# Altium project CW341_KintexUltraScaleTarget.PrjPcb (part 1 of 3)
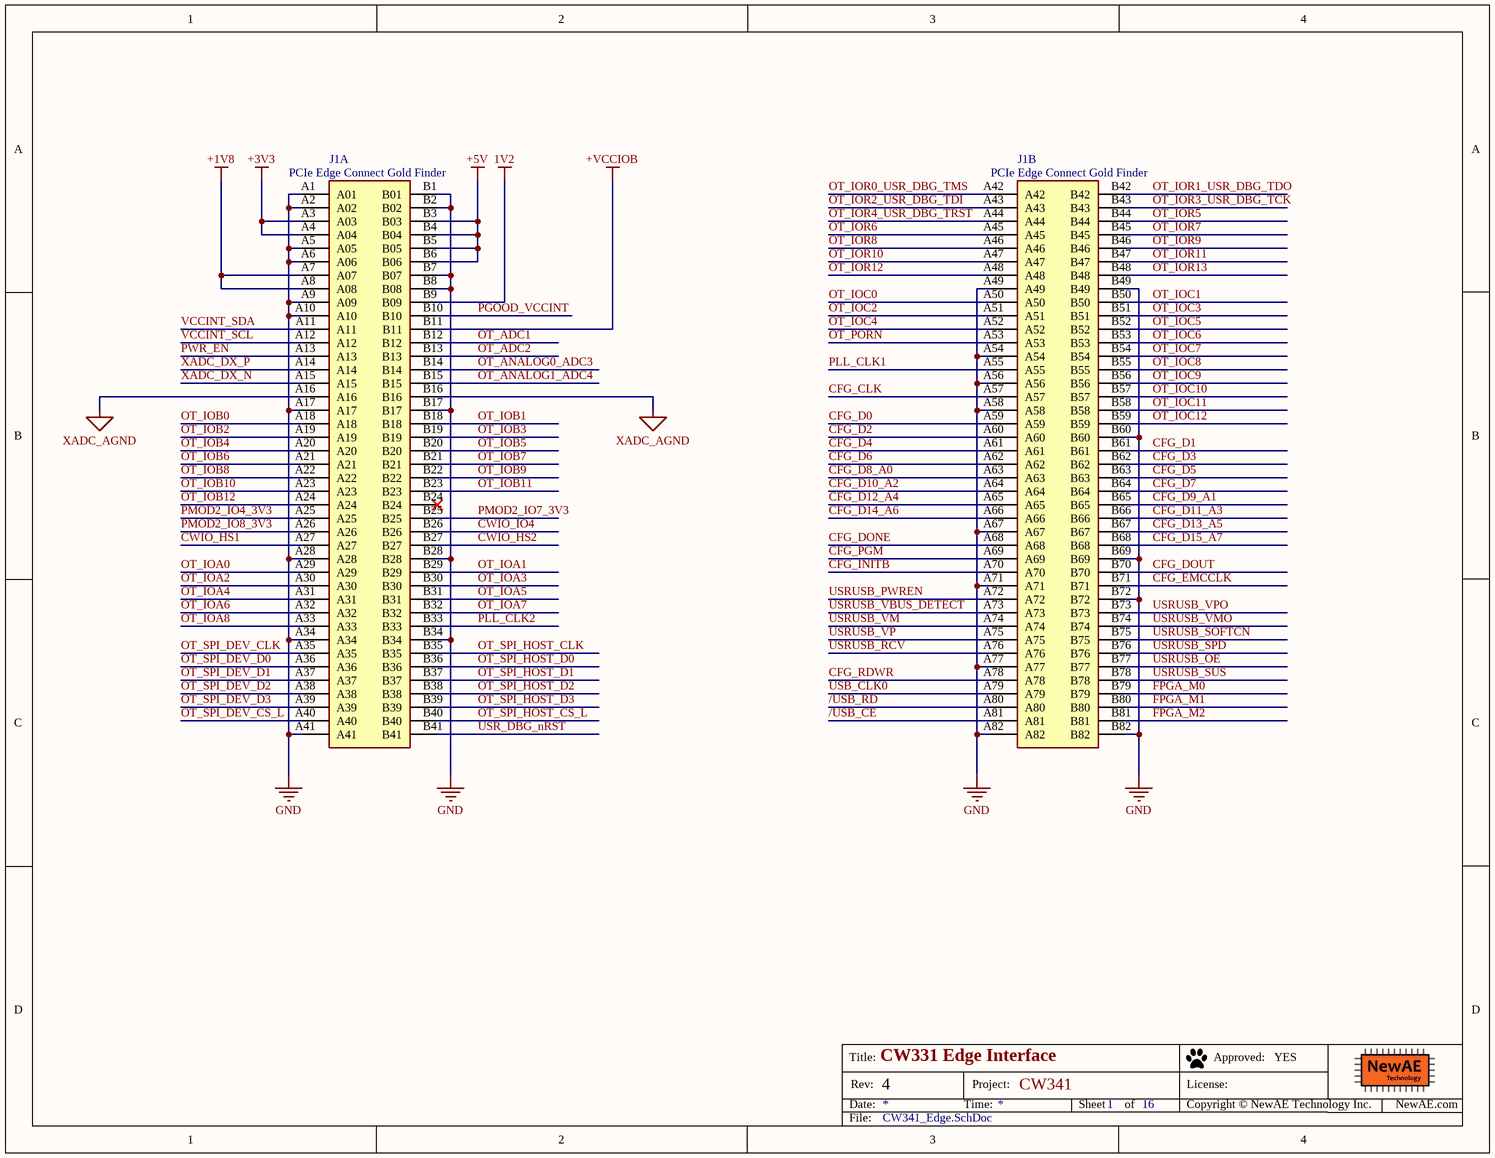
[diagram p0: CW341_Edge.SchDoc]
Sch_date: 01/17/2023; PrjRev: 4; PrjName: CW341
16 sheets, 157 parts. Net scope: global (net labels, ports and power ports of the same name join across sheets).
Board file: CW341_KintexUSTarget.PcbDoc
Sheets:
  CW341_Edge.SchDoc
  CW341_FPGA_DECOUP.SchDoc
  CW341_FPGA_PWR.SchDoc
  CW341_FPGA_CFG.SchDoc
  CW341_FPGA_MGT.SchDoc
  CW341_FPGAIO_1.SchDoc
  CW341_FPGAIO_2.SchDoc
  CW341_FPGAIO_3.SchDoc
  CW341_FPGAIO_4.SchDoc
  CW341_FPGAIO_5.SchDoc
  CW341_HeatsinkFan.SchDoc
  CW341_PowerMeasure.SchDoc
  CW341_SRAM.SchDoc
  CW341_XADC.SchDoc
  CW341_HyperRam.SchDoc
  CW341_FPGA_USERIOA.SchDoc

## Sheet CW341_Edge.SchDoc: CW331 Edge Interface
size Letter; Organization: NewAE Technology Inc.; Address1: 1083 Queen St., Suite 196; Address2: Halifax; Address3: NS; Address4: Canada B3H 0B2; SheetNumber: 1; SheetTotal: 16; SheetApproved: YES

### Parts
J1  PCIe Edge Connect Gold Finder  [PCIeX16-GF-2D-1000-1K-O164]  (parts A,B of 2)

### Nets
1V2: J1.B9(B09)
+1V8: J1.A7(A07) J1.A8(A08)
+3V3: J1.A3(A03) J1.A4(A04)
+5V: J1.B3(B03) J1.B4(B04) J1.B5(B05) J1.B6(B06)
+VCCIOB: J1.B11
GND: J1.A1(A01) J1.A2(A02) J1.A5(A05) J1.A6(A06) J1.A9(A09) J1.A10 J1.A17 J1.A28 J1.A34 J1.A41 J1.A49 J1.A54 J1.A56 J1.A58 J1.A67 J1.A71 J1.A77 J1.A82 J1.B1(B01) J1.B2(B02) J1.B7(B07) J1.B8(B08) J1.B17 J1.B28 J1.B34 J1.B49 J1.B60 J1.B69 J1.B72 J1.B82
XADC_AGND: J1.A16 J1.B16  [project net XADC_VREF_N]
/USB_CE: J1.A81
/USB_RD: J1.A80
CFG_CLK: J1.A57
CFG_D0: J1.A59
CFG_D1: J1.B61
CFG_D2: J1.A60
CFG_D3: J1.B62
CFG_D4: J1.A61
CFG_D5: J1.B63
CFG_D6: J1.A62
CFG_D7: J1.B64
CFG_D8_A0: J1.A63
CFG_D9_A1: J1.B65
CFG_D10_A2: J1.A64
CFG_D11_A3: J1.B66
CFG_D12_A4: J1.A65
CFG_D13_A5: J1.B67
CFG_D14_A6: J1.A66
CFG_D15_A7: J1.B68
CFG_DONE: J1.A68
CFG_DOUT: J1.B70
CFG_EMCCLK: J1.B71
CFG_INITB: J1.A70
CFG_PGM: J1.A69
CFG_RDWR: J1.A78
CWIO_HS1: J1.A27
CWIO_HS2: J1.B27
CWIO_IO4: J1.B26
FPGA_M0: J1.B79
FPGA_M1: J1.B80
FPGA_M2: J1.B81
OT_ADC1: J1.B12
OT_ADC2: J1.B13
OT_ANALOG0_ADC3: J1.B14
OT_ANALOG1_ADC4: J1.B15
OT_IOA0: J1.A29
OT_IOA1: J1.B29
OT_IOA2: J1.A30
OT_IOA3: J1.B30
OT_IOA4: J1.A31
OT_IOA5: J1.B31
OT_IOA6: J1.A32
OT_IOA7: J1.B32
OT_IOA8: J1.A33
OT_IOB0: J1.A18
OT_IOB1: J1.B18
OT_IOB2: J1.A19
OT_IOB3: J1.B19
OT_IOB4: J1.A20
OT_IOB5: J1.B20
OT_IOB6: J1.A21
OT_IOB7: J1.B21
OT_IOB8: J1.A22
OT_IOB9: J1.B22
OT_IOB10: J1.A23
OT_IOB11: J1.B23
OT_IOB12: J1.A24
OT_IOC0: J1.A50
OT_IOC1: J1.B50
OT_IOC2: J1.A51
OT_IOC3: J1.B51
OT_IOC4: J1.A52
OT_IOC5: J1.B52
OT_IOC6: J1.B53
OT_IOC7: J1.B54
OT_IOC8: J1.B55
OT_IOC9: J1.B56
OT_IOC10: J1.B57
OT_IOC11: J1.B58
OT_IOC12: J1.B59
OT_IOR0_USR_DBG_TMS: J1.A42
OT_IOR1_USR_DBG_TDO: J1.B42
OT_IOR2_USR_DBG_TDI: J1.A43
OT_IOR3_USR_DBG_TCK: J1.B43
OT_IOR4_USR_DBG_TRST: J1.A44
OT_IOR5: J1.B44
OT_IOR6: J1.A45
OT_IOR7: J1.B45
OT_IOR8: J1.A46
OT_IOR9: J1.B46
OT_IOR10: J1.A47
OT_IOR11: J1.B47
OT_IOR12: J1.A48
OT_IOR13: J1.B48
OT_PORN: J1.A53
OT_SPI_DEV_CLK: J1.A35
OT_SPI_DEV_CS_L: J1.A40
OT_SPI_DEV_D0: J1.A36
OT_SPI_DEV_D1: J1.A37
OT_SPI_DEV_D2: J1.A38
OT_SPI_DEV_D3: J1.A39
OT_SPI_HOST_CLK: J1.B35
OT_SPI_HOST_CS_L: J1.B40
OT_SPI_HOST_D0: J1.B36
OT_SPI_HOST_D1: J1.B37
OT_SPI_HOST_D2: J1.B38
OT_SPI_HOST_D3: J1.B39
PGOOD_VCCINT: J1.B10
PLL_CLK1: J1.A55
PLL_CLK2: J1.B33
PMOD2_IO4_3V3: J1.A25
PMOD2_IO7_3V3: J1.B25
PMOD2_IO8_3V3: J1.A26
PWR_EN: J1.A13
USB_CLK0: J1.A79
USR_DBG_nRST: J1.B41
USRUSB_OE: J1.B77
USRUSB_PWREN: J1.A72
USRUSB_RCV: J1.A76
USRUSB_SOFTCN: J1.B75
USRUSB_SPD: J1.B76
USRUSB_SUS: J1.B78
USRUSB_VBUS_DETECT: J1.A73
USRUSB_VM: J1.A74
USRUSB_VMO: J1.B74
USRUSB_VP: J1.A75
USRUSB_VPO: J1.B73
VCCINT_SCL: J1.A12
VCCINT_SDA: J1.A11
XADC_DX_N: J1.A15
XADC_DX_P: J1.A14

Not connected (* = marked no-connect by the designer): J1 B24*

### Notes on the sheet
- Title:
- Date:
- Rev:
- Time:
- Project:
- Sheet
- of
- License:
- Copyright © NewAE Technology Inc.
- Approved:
- NewAE.com
- File:

### Library data of the parts
J1 = PCIe x16 Connector Edge (gold finger, x8 mode): Edge Fingers No Part to Install; MF: NA; MP: PCIE-164-02-X-D-RA; Value: *; Price: NA; Package: PCIeX16-GF-2D-1000-1K-O164

## Sheet CW341_FPGA_DECOUP.SchDoc: FPGA Decoupling
size Letter; SheetNumber: 2; SheetTotal: 16; SheetApproved: YES; Application_BuildNumber: .
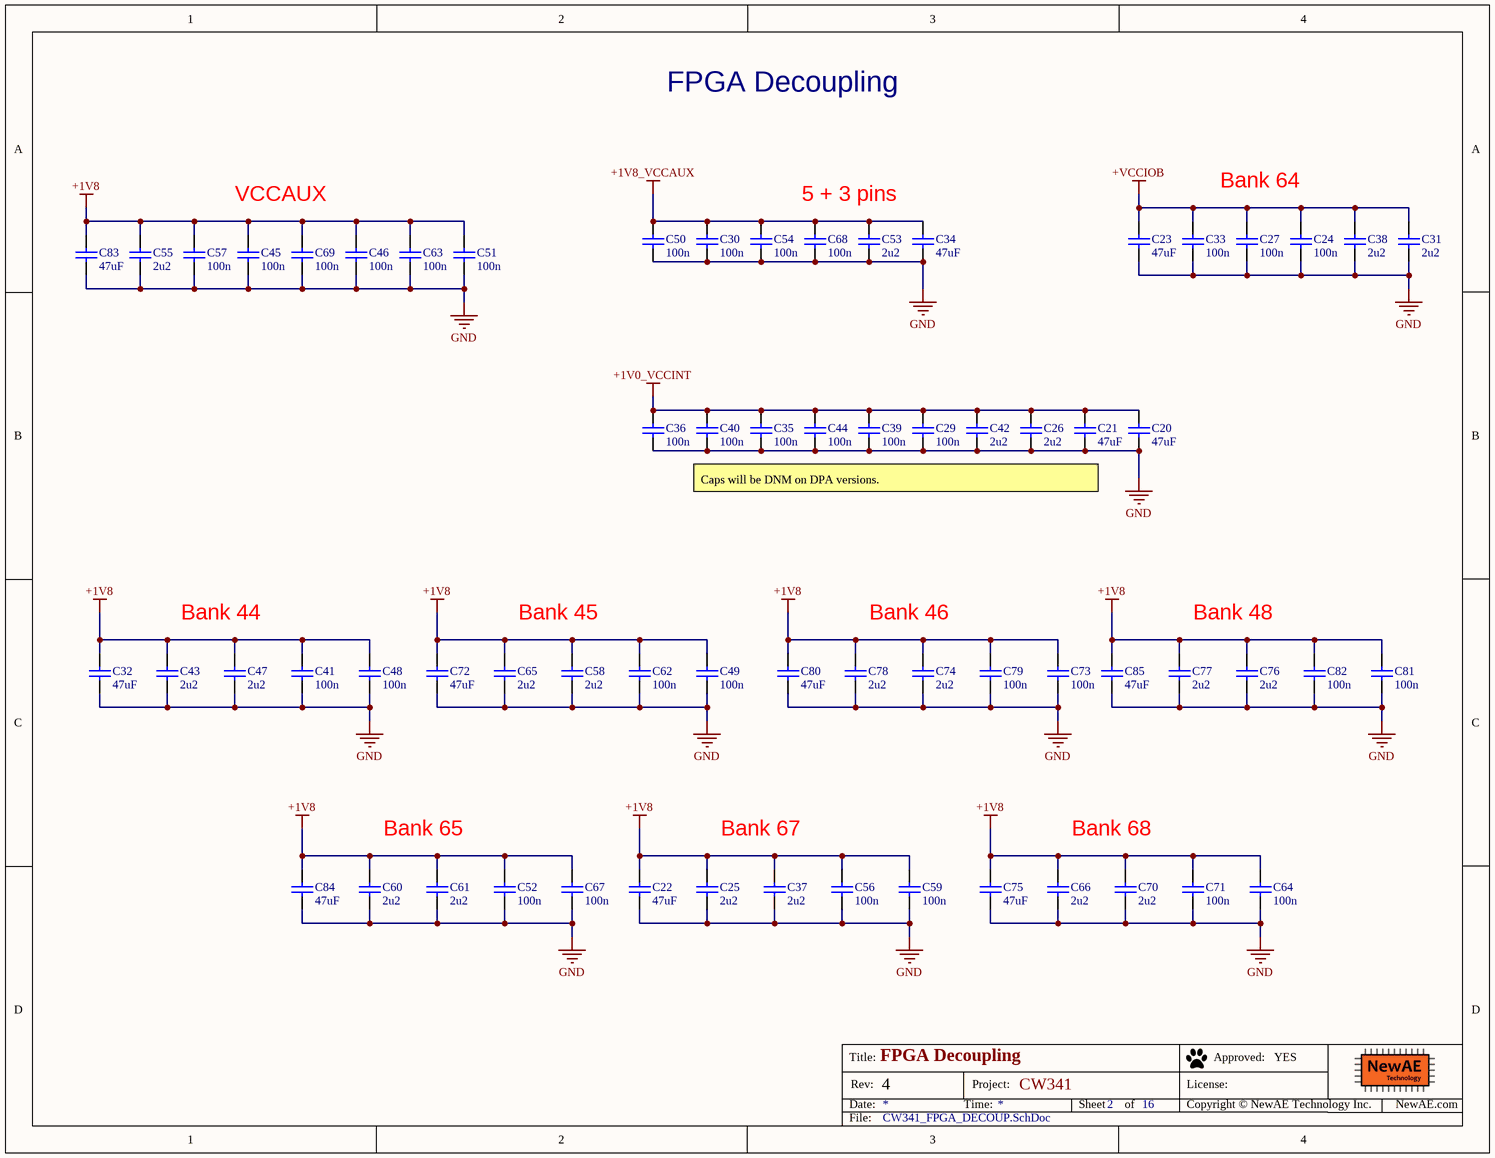
[diagram p1: CW341_FPGA_DECOUP.SchDoc]

### Parts
C20  47uF  [CAPC3225X20N]
C21  47uF  [CAPC3225X20N]
C22  47uF  [CAPC3225X20N]
C23  47uF  [CAPC3225X20N]
C24  100n  [CAPC0402_M]
C25  2u2  [CAPC0603_M]
C26  2u2  [CAPC0603_M]
C27  100n  [CAPC0402_M]
C29  100n  [CAPC0402_M]
C30  100n  [CAPC0402_M]
C31  2u2  [CAPC0603_M]
C32  47uF  [CAPC3225X20N]
C33  100n  [CAPC0402_M]
C34  47uF  [CAPC3225X20N]
C35  100n  [CAPC0402_M]
C36  100n  [CAPC0402_M]
C37  2u2  [CAPC0603_M]
C38  2u2  [CAPC0603_M]
C39  100n  [CAPC0402_M]
C40  100n  [CAPC0402_M]
C41  100n  [CAPC0402_M]
C42  2u2  [CAPC0603_M]
C43  2u2  [CAPC0603_M]
C44  100n  [CAPC0402_M]
C45  100n  [CAPC0402_M]
C46  100n  [CAPC0402_M]
C47  2u2  [CAPC0603_M]
C48  100n  [CAPC0402_M]
C49  100n  [CAPC0402_M]
C50  100n  [CAPC0402_M]
C51  100n  [CAPC0402_M]
C52  100n  [CAPC0402_M]
C53  2u2  [CAPC0603_M]
C54  100n  [CAPC0402_M]
C55  2u2  [CAPC0603_M]
C56  100n  [CAPC0402_M]
C57  100n  [CAPC0402_M]
C58  2u2  [CAPC0603_M]
C59  100n  [CAPC0402_M]
C60  2u2  [CAPC0603_M]
C61  2u2  [CAPC0603_M]
C62  100n  [CAPC0402_M]
C63  100n  [CAPC0402_M]
C64  100n  [CAPC0402_M]
C65  2u2  [CAPC0603_M]
C66  2u2  [CAPC0603_M]
C67  100n  [CAPC0402_M]
C68  100n  [CAPC0402_M]
C69  100n  [CAPC0402_M]
C70  2u2  [CAPC0603_M]
C71  100n  [CAPC0402_M]
C72  47uF  [CAPC3225X20N]
C73  100n  [CAPC0402_M]
C74  2u2  [CAPC0603_M]
C75  47uF  [CAPC3225X20N]
C76  2u2  [CAPC0603_M]
C77  2u2  [CAPC0603_M]
C78  2u2  [CAPC0603_M]
C79  100n  [CAPC0402_M]
C80  47uF  [CAPC3225X20N]
C81  100n  [CAPC0402_M]
C82  100n  [CAPC0402_M]
C83  47uF  [CAPC3225X20N]
C84  47uF  [CAPC3225X20N]
C85  47uF  [CAPC3225X20N]

### Nets
+1V0_VCCINT: C20.1 C21.1 C26.1 C29.1 C35.1 C36.1 C39.1 C40.1 C42.1 C44.1
+1V8: C22.1 C25.1 C30.1 C32.1 C34.1 C37.1 C41.1 C43.1 C45.1 C46.1 C47.1 C48.1 C49.1 C50.1 C51.1 C52.1 C53.1 C54.1 C55.1 C56.1 C57.1 C58.1 C59.1 C60.1 C61.1 C62.1 C63.1 C64.1 C65.1 C66.1 C67.1 C68.1 C69.1 C70.1 C71.1 C72.1 C73.1 C74.1 C75.1 C76.1 C77.1 C78.1 C79.1 C80.1 C81.1 C82.1 C83.1 C84.1 C85.1  [also labelled +1V8_VCCAUX]
+VCCIOB: C23.1 C24.1 C27.1 C31.1 C33.1 C38.1
GND: C20.2 C21.2 C22.2 C23.2 C24.2 C25.2 C26.2 C27.2 C29.2 C30.2 C31.2 C32.2 C33.2 C34.2 C35.2 C36.2 C37.2 C38.2 C39.2 C40.2 C41.2 C42.2 C43.2 C44.2 C45.2 C46.2 C47.2 C48.2 C49.2 C50.2 C51.2 C52.2 C53.2 C54.2 C55.2 C56.2 C57.2 C58.2 C59.2 C60.2 C61.2 C62.2 C63.2 C64.2 C65.2 C66.2 C67.2 C68.2 C69.2 C70.2 C71.2 C72.2 C73.2 C74.2 C75.2 C76.2 C77.2 C78.2 C79.2 C80.2 C81.2 C82.2 C83.2 C84.2 C85.2

### Notes on the sheet
- FPGA Decoupling
- VCCAUX
- 5 + 3 pins
- Bank 64
- Caps will be DNM on DPA versions.
- Bank 44
- Bank 45
- Bank 46
- Bank 48
- Bank 65
- Bank 67
- Bank 68
- Title:
- Date:
- Rev:
- Time:
- Project:
- Sheet
- of
- License:
- Copyright © NewAE Technology Inc.
- Approved:
- NewAE.com
- File:

### Library data of the parts
C20-C23 C32 C34 C72 C75 C80 C83-C85 = CCHIP-47u-1210: 47u, 10V, 1210, Ceramic; Manufacture 1: TDK Corporation; Manufacture Part Number 1: C3225X5R1A476M250AC; Component Group: Capacitor; Case-EIA: 1210; Case-Metric: 3225; Rated Voltage: 10VDC; Tolerance: 20%; Part Number: CCHIP-47u-1210; Footprint: 1210; Pin Count: 2; Supplier 1: Digi-Key; Supplier Part Number 1: 445-6711-1-ND; Value: 47uF; Mounting Technology: SMT; Temperature Range: -55C to 85C; Component Kind: Standard; Component Type: Standard
C24 C27 C29 C30 C33 C35 C36 C39-C41 C44-C46 C48-C52 C54 C56 C57 C59 C62-C64 C67-C69 C71 C73 C79 C81 C82 = CCHIP-100n-0402: 100n, 0402; Manufacture Part Number 1: CGA2B3X7R1V104K050BB; Component Group: Capacitor; Case-EIA: 0402; Part Number: CCHIP-100n-0402; Footprint: 0402; Pin Count: 2; Value: 100n; Mounting Technology: SMT; Component Kind: Standard; Component Type: Standard; Supplier 1: Digi-Key; Supplier Part Number 1: 445-6901-1-ND
C25 C26 C31 C37 C38 C42 C43 C47 C53 C55 C58 C60 C61 C65 C66 C70 C74 C76-C78 = CCHIP-2u2-0603: 2u2, 0603; Manufacture 1: Samsung; Manufacture Part Number 1: CL10B225KP8NNNC; Component Group: Capacitor; Case-EIA: 0603; Case-Metric: 1608; Rated Voltage: 10VDC; Part Number: CCHIP-2u2-0603; Footprint: 0603; Pin Count: 2; Supplier 1: Digi-Key; Supplier Part Number 1: 1276-1134-1-ND; Value: 2u2; Mounting Technology: SMT; Component Kind: Standard; Component Type: Standard

## Sheet CW341_FPGA_PWR.SchDoc: Kintex Power Connections
size Letter; Organization: NewAE Technology Inc.; Address1: 1083 Queen St., Suite 196; Address2: Halifax; Address3: NS; Address4: Canada B3H 0B2; SheetNumber: 3; SheetTotal: 16; SheetApproved: YES
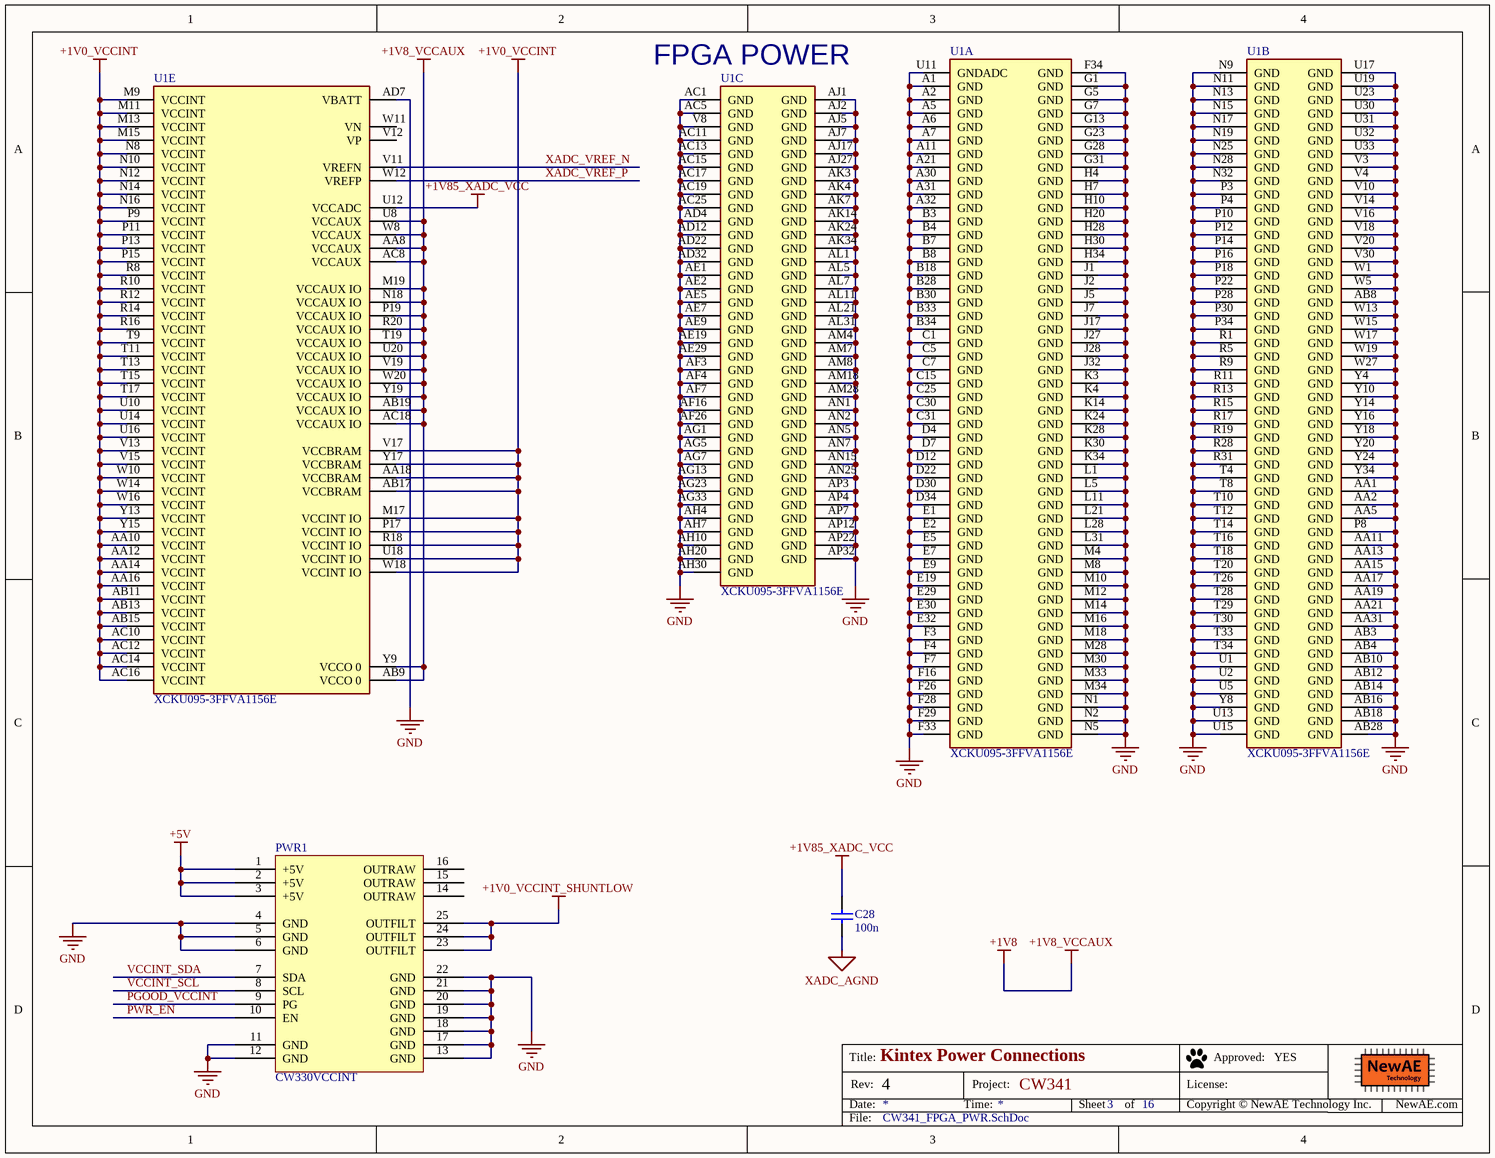
[diagram p2: CW341_FPGA_PWR.SchDoc]

### Parts
C28  100n  [CAPC0402_M]
PWR1  CW330VCCINT  [CW335_VCCINT_POWERSUPPLY]
U1  XCKU095-3FFVA1156E  [FP-XCKU060-3FFVA1156E-MFG]  (parts A,B,C,E of 23)

### Nets
+1V0_VCCINT: U1.AA10(VCCINT) U1.AA12(VCCINT) U1.AA14(VCCINT) U1.AA16(VCCINT) U1.AA18(VCCBRAM) U1.AB11(VCCINT) U1.AB13(VCCINT) U1.AB15(VCCINT) U1.AB17(VCCBRAM) U1.AC10(VCCINT) U1.AC12(VCCINT) U1.AC14(VCCINT) U1.AC16(VCCINT) U1.M9(VCCINT) U1.M11(VCCINT) U1.M13(VCCINT) U1.M15(VCCINT) U1.M17(VCCINT_IO) U1.N8(VCCINT) U1.N10(VCCINT) U1.N12(VCCINT) U1.N14(VCCINT) U1.N16(VCCINT) U1.P9(VCCINT) U1.P11(VCCINT) U1.P13(VCCINT) U1.P15(VCCINT) U1.P17(VCCINT_IO) U1.R8(VCCINT) U1.R10(VCCINT) U1.R12(VCCINT) U1.R14(VCCINT) U1.R16(VCCINT) U1.R18(VCCINT_IO) U1.T9(VCCINT) U1.T11(VCCINT) U1.T13(VCCINT) U1.T15(VCCINT) U1.T17(VCCINT) U1.U10(VCCINT) U1.U14(VCCINT) U1.U16(VCCINT) U1.U18(VCCINT_IO) U1.V13(VCCINT) U1.V15(VCCINT) U1.V17(VCCBRAM) U1.W10(VCCINT) U1.W14(VCCINT) U1.W16(VCCINT) U1.W18(VCCINT_IO) U1.Y13(VCCINT) U1.Y15(VCCINT) U1.Y17(VCCBRAM)
+1V0_VCCINT_SHUNTLOW: PWR1.23(OUTFILT) PWR1.24(OUTFILT) PWR1.25(OUTFILT)
+1V8: U1.AA8(VCCAUX) U1.AB9(VCCO_0) U1.AB19(VCCAUX_IO) U1.AC8(VCCAUX) U1.AC18(VCCAUX_IO) U1.M19(VCCAUX_IO) U1.N18(VCCAUX_IO) U1.P19(VCCAUX_IO) U1.R20(VCCAUX_IO) U1.T19(VCCAUX_IO) U1.U8(VCCAUX) U1.U20(VCCAUX_IO) U1.V19(VCCAUX_IO) U1.W8(VCCAUX) U1.W20(VCCAUX_IO) U1.Y9(VCCO_0) U1.Y19(VCCAUX_IO)  [also labelled +1V8_VCCAUX]
+1V85_XADC_VCC: C28.1 U1.U12(VCCADC)
+5V: PWR1.1(+5V) PWR1.2(+5V) PWR1.3(+5V)
GND: PWR1.4(GND) PWR1.5(GND) PWR1.6(GND) PWR1.11(GND) PWR1.12(GND) PWR1.13(GND) PWR1.17(GND) PWR1.18(GND) PWR1.19(GND) PWR1.20(GND) PWR1.21(GND) PWR1.22(GND) U1.A1(GND) U1.A2(GND) U1.A5(GND) U1.A6(GND) U1.A7(GND) U1.A11(GND) U1.A21(GND) U1.A30(GND) U1.A31(GND) U1.A32(GND) U1.AA1(GND) U1.AA2(GND) U1.AA5(GND) U1.AA11(GND) U1.AA13(GND) U1.AA15(GND) U1.AA17(GND) U1.AA19(GND) U1.AA21(GND) U1.AA31(GND) U1.AB3(GND) U1.AB4(GND) U1.AB8(GND) U1.AB10(GND) U1.AB12(GND) U1.AB14(GND) U1.AB16(GND) U1.AB18(GND) U1.AB28(GND) U1.AC1(GND) U1.AC5(GND) U1.AC11(GND) U1.AC13(GND) U1.AC15(GND) U1.AC17(GND) U1.AC19(GND) U1.AC25(GND) U1.AD4(GND) U1.AD7(VBATT) U1.AD12(GND) U1.AD22(GND) U1.AD32(GND) U1.AE1(GND) U1.AE2(GND) U1.AE5(GND) U1.AE7(GND) U1.AE9(GND) U1.AE19(GND) U1.AE29(GND) U1.AF3(GND) U1.AF4(GND) U1.AF7(GND) U1.AF16(GND) U1.AF26(GND) U1.AG1(GND) U1.AG5(GND) U1.AG7(GND) U1.AG13(GND) U1.AG23(GND) U1.AG33(GND) U1.AH4(GND) U1.AH7(GND) U1.AH10(GND) U1.AH20(GND) U1.AH30(GND) U1.AJ1(GND) U1.AJ2(GND) U1.AJ5(GND) U1.AJ7(GND) U1.AJ17(GND) U1.AJ27(GND) U1.AK3(GND) U1.AK4(GND) U1.AK7(GND) U1.AK14(GND) U1.AK24(GND) U1.AK34(GND) U1.AL1(GND) U1.AL5(GND) U1.AL7(GND) U1.AL11(GND) U1.AL21(GND) U1.AL31(GND) U1.AM4(GND) U1.AM7(GND) U1.AM8(GND) U1.AM18(GND) U1.AM28(GND) U1.AN1(GND) U1.AN2(GND) U1.AN5(GND) U1.AN7(GND) U1.AN15(GND) U1.AN25(GND) U1.AP3(GND) U1.AP4(GND) U1.AP7(GND) U1.AP12(GND) U1.AP22(GND) U1.AP32(GND) U1.B3(GND) U1.B4(GND) U1.B7(GND) U1.B8(GND) U1.B18(GND) U1.B28(GND) U1.B30(GND) U1.B33(GND) U1.B34(GND) U1.C1(GND) U1.C5(GND) U1.C7(GND) U1.C15(GND) U1.C25(GND) U1.C30(GND) U1.C31(GND) U1.D4(GND) U1.D7(GND) U1.D12(GND) U1.D22(GND) U1.D30(GND) U1.D34(GND) U1.E1(GND) U1.E2(GND) U1.E5(GND) U1.E7(GND) U1.E9(GND) U1.E19(GND) U1.E29(GND) U1.E30(GND) U1.E32(GND) U1.F3(GND) U1.F4(GND) U1.F7(GND) U1.F16(GND) U1.F26(GND) U1.F28(GND) U1.F29(GND) U1.F33(GND) U1.F34(GND) U1.G1(GND) U1.G5(GND) U1.G7(GND) U1.G13(GND) U1.G23(GND) U1.G28(GND) U1.G31(GND) U1.H4(GND) U1.H7(GND) U1.H10(GND) U1.H20(GND) U1.H28(GND) U1.H30(GND) U1.H34(GND) U1.J1(GND) U1.J2(GND) U1.J5(GND) U1.J7(GND) U1.J17(GND) U1.J27(GND) U1.J28(GND) U1.J32(GND) U1.K3(GND) U1.K4(GND) U1.K14(GND) U1.K24(GND) U1.K28(GND) U1.K30(GND) U1.K34(GND) U1.L1(GND) U1.L5(GND) U1.L11(GND) U1.L21(GND) U1.L28(GND) U1.L31(GND) U1.M4(GND) U1.M8(GND) U1.M10(GND) U1.M12(GND) U1.M14(GND) U1.M16(GND) U1.M18(GND) U1.M28(GND) U1.M30(GND) U1.M33(GND) U1.M34(GND) U1.N1(GND) U1.N2(GND) U1.N5(GND) U1.N9(GND) U1.N11(GND) U1.N13(GND) U1.N15(GND) U1.N17(GND) U1.N19(GND) U1.N25(GND) U1.N28(GND) U1.N32(GND) U1.P3(GND) U1.P4(GND) U1.P8(GND) U1.P10(GND) U1.P12(GND) U1.P14(GND) U1.P16(GND) U1.P18(GND) U1.P22(GND) U1.P28(GND) U1.P30(GND) U1.P34(GND) U1.R1(GND) U1.R5(GND) U1.R9(GND) U1.R11(GND) U1.R13(GND) U1.R15(GND) U1.R17(GND) U1.R19(GND) U1.R28(GND) U1.R31(GND) U1.T4(GND) U1.T8(GND) U1.T10(GND) U1.T12(GND) U1.T14(GND) U1.T16(GND) U1.T18(GND) U1.T20(GND) U1.T26(GND) U1.T28(GND) U1.T29(GND) U1.T30(GND) U1.T33(GND) U1.T34(GND) U1.U1(GND) U1.U2(GND) U1.U5(GND) U1.U11(GNDADC) U1.U13(GND) U1.U15(GND) U1.U17(GND) U1.U19(GND) U1.U23(GND) U1.U30(GND) U1.U31(GND) U1.U32(GND) U1.U33(GND) U1.V3(GND) U1.V4(GND) U1.V8(GND) U1.V10(GND) U1.V14(GND) U1.V16(GND) U1.V18(GND) U1.V20(GND) U1.V30(GND) U1.W1(GND) U1.W5(GND) U1.W13(GND) U1.W15(GND) U1.W17(GND) U1.W19(GND) U1.W27(GND) U1.Y4(GND) U1.Y8(GND) U1.Y10(GND) U1.Y14(GND) U1.Y16(GND) U1.Y18(GND) U1.Y20(GND) U1.Y24(GND) U1.Y34(GND)
XADC_VREF_N: C28.2 U1.V11(VREFN)  [also labelled XADC_AGND]
PGOOD_VCCINT: PWR1.9(PG)
PWR_EN: PWR1.10(EN)
VCCINT_SCL: PWR1.8(SCL)
VCCINT_SDA: PWR1.7(SDA)
XADC_VREF_P: U1.W12(VREFP)

Not connected (* = marked no-connect by the designer): PWR1 14(OUTRAW) 15(OUTRAW) 16(OUTRAW); U1 V12(VP) W11(VN)

### Notes on the sheet
- (near U1) FPGA POWER
- Title:
- Date:
- Rev:
- Time:
- Project:
- Sheet
- of
- License:
- Copyright © NewAE Technology Inc.
- Approved:
- NewAE.com
- File:

### Library data of the parts
C28 = CCHIP-100n-0402: as C24 on sheet CW341_FPGA_DECOUP; Part Number: CCHIP-100n-0402; Footprint: 0402; Pin Count: 2; Value: 100n; Mounting Technology: SMT; Component Kind: Standard; Component Type: Standard; Supplier 1: Digi-Key; Supplier Part Number 1: 445-6901-1-ND
U1 = IC-XCKU095-1156: IC FPGA 520 I/O 1156FCBGA; Manufacturer: Xilinx; Manufacturer Part Number: XCKU060-3FFVA1156E; Standoff Height: 0.4mm; Ram Size: 38MBytes; Min Supply Voltage: 0.97V; Max Junction Temp: +100°C; Max Supply Voltage: 1.8V; Number Of Logic Elements Cells: 1176000; Number Of I/Os: 520; Speed Grade: 3; Memory Type: RAM; Ipc Land Pattern Name: BGA1156N100P34X34_3500X3500X342; RoHS: TRUE; Height: 3.51mm; Footprint Url: https://www.xilinx.com/support/documentation/user_guides/ug575-ultrascale-pkg-pinout.pdf; Device Class L2: Embedded Processors and Controllers; ComponentLink2URL: https://www.xilinx.com/support/documentation/data_sheets/ds890-ultrascale-overview.pdf; Temperature Range High: +100°C; Device Class L1: Integrated Circuits (ICs); Package: 0; Octopart: https://octopart.com/xcku035-3ffva1156e-xilinx-67038192?r=sp; Automotive: No; ComponentLink2Description: Datasheet; Device Class L3: FPGAs - Field Programmable Gate Arrays; Category: IC; Lead Free: Yes; Temperature: 0°C to +100°C; Temperature Range Low: 0°C; Digikey Description: IC FPGA 520 I/O 1156FCBGA

## Sheet CW341_FPGA_CFG.SchDoc: Kintex CFG
size Letter; Organization: NewAE Technology Inc.; Address1: 1083 Queen St., Suite 196; Address2: Halifax; Address3: NS; Address4: Canada B3H 0B2; SheetNumber: 4; SheetTotal: 16; SheetApproved: YES
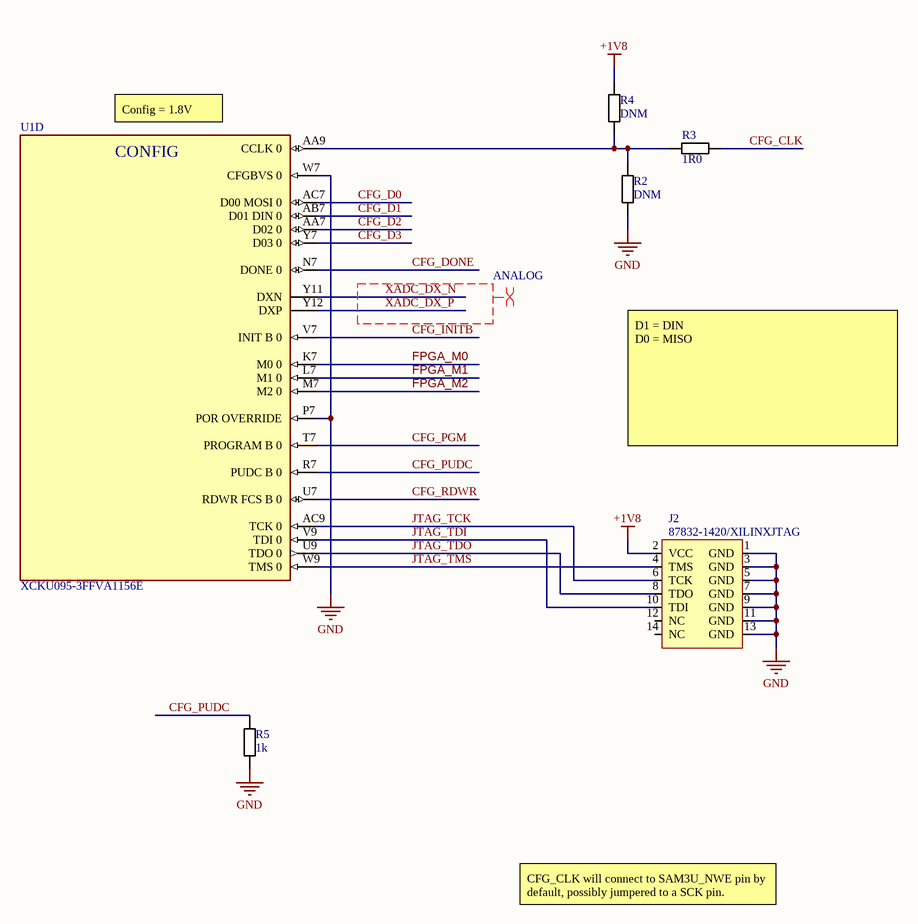
[diagram p3: CW341_FPGA_CFG.SchDoc]

### Parts
J2  87832-1420/XILINXJTAG  [87832-1420]
R2  DNM  [RESC1005X40N]
R3  1R0  [RESC1005X40N]
R4  DNM  [RESC1005X40N]
R5  1k  [RESC1005X40N]
U1  XCKU095-3FFVA1156E  [FP-XCKU060-3FFVA1156E-MFG]  (part D of 23)

### Nets
+1V8: J2.2(VCC) R4.1
GND: J2.1(GND) J2.3(GND) J2.5(GND) J2.7(GND) J2.9(GND) J2.11(GND) J2.13(GND) R2.2 R5.2 U1.P7(POR_OVERRIDE) U1.W7(CFGBVS_0)
CFG_CLK: R3.2
CFG_D0: U1.AC7(D00_MOSI_0)
CFG_D1: U1.AB7(D01_DIN_0)
CFG_D2: U1.AA7(D02_0)
CFG_D3: U1.Y7(D03_0)
CFG_DONE: U1.N7(DONE_0)
CFG_INITB: U1.V7(INIT_B_0)
CFG_PGM: U1.T7(PROGRAM_B_0)
CFG_PUDC: R5.1 U1.R7(PUDC_B_0)
CFG_RDWR: U1.U7(RDWR_FCS_B_0)
FPGA_M0: U1.K7(M0_0)
FPGA_M1: U1.L7(M1_0)
FPGA_M2: U1.M7(M2_0)
JTAG_TCK: J2.6(TCK) U1.AC9(TCK_0)
JTAG_TDI: J2.10(TDI) U1.V9(TDI_0)
JTAG_TDO: J2.8(TDO) U1.U9(TDO_0)
JTAG_TMS: J2.4(TMS) U1.W9(TMS_0)
XADC_DX_N: U1.Y11(DXN)
XADC_DX_P: U1.Y12(DXP)
NetR2_1: R2.1 R3.1 R4.2 U1.AA9(CCLK_0)

Not connected (* = marked no-connect by the designer): J2 12(NC) 14(NC)

### Layout directives
differential pair; differential pair class ANALOG: XADC_DX_N, XADC_DX_P

### Notes on the sheet
- Config = 1.8V
- D1 = DIN
  D0 = MISO
- CFG_CLK will connect to SAM3U_NWE pin by default, possibly jumpered to a SCK pin.
- Title:
- Date:
- Rev:
- Time:
- Project:
- Sheet
- of
- License:
- Copyright © NewAE Technology Inc.
- Approved:
- NewAE.com
- File:
- (in symbol IC-XCKU095-1156, part D) CONFIG

### Library data of the parts
J2 = 87832-1420/XILINXJTAG: Molex 14-pin SMD, JTAG Pinout; Manufacture 1: Molex; Manufacture 1 Part Number: 87832-1420; Supplier 1: Digi-Key; Supplier Part Number 1: WM18641-ND
R2 R4 = RCHIP-DNM-0402: Component Group: Resistor; Case-EIA: 0402; Case-Metric: 1005; Part Number: RCHIP-DNM-0402; Footprint: 0402; Pin Count: 2; Value: DNM; Component Kind: Standard; Component Type: Standard
R3 = RCHIP-1R0-0402: 1R0 res, 0402, 1%, 1/16W; Manufacture 1: Yageo; Manufacture Part Number 1: RC0402FR-071RL; Component Group: Resistor; Case-EIA: 0402; Case-Metric: 1005; Rated Power: 0.063W; Rated Voltage: 75VDC; Part Number: RCHIP-1R0-0402; Footprint: 0402; Pin Count: 2; Supplier 1: Digi-Key; Supplier Part Number 1: 311-1.00LRCT-ND; Value: 1R0; Tolerance: 1%; Mounting Technology: SMT; Temperature Range: -55C to 155C; Component Kind: Standard; Component Type: Standard
R5 = RCHIP-1K-0402: 1k res, 0402, 1%, 1/16W; Manufacture 1: Yageo; Manufacture Part Number 1: RC0402FR-071KL; Component Group: Resistor; Case-EIA: 0402; Case-Metric: 1005; Rated Power: 0.063W; Rated Voltage: 75VDC; Part Number: RCHIP-1K-0402; Footprint: 0402; Pin Count: 2; Supplier 1: Digi-Key; Supplier Part Number 1: 311-1.00KLRCT-ND; Value: 1k; Tolerance: 1%; Mounting Technology: SMT; Temperature Range: -55C to 155C; Component Kind: Standard; Component Type: Standard
U1 = IC-XCKU095-1156: as U1 on sheet CW341_FPGA_PWR; Ipc Land Pattern Name: BGA1156N100P34X34_3500X3500X342; RoHS: TRUE; Height: 3.51mm; Footprint Url: https://www.xilinx.com/support/documentation/user_guides/ug575-ultrascale-pkg-pinout.pdf; Device Class L2: Embedded Processors and Controllers; ComponentLink2URL: https://www.xilinx.com/support/documentation/data_sheets/ds890-ultrascale-overview.pdf; Temperature Range High: +100°C; Device Class L1: Integrated Circuits (ICs); Package: 0; Octopart: https://octopart.com/xcku035-3ffva1156e-xilinx-67038192?r=sp; Automotive: No; ComponentLink2Description: Datasheet; Device Class L3: FPGAs - Field Programmable Gate Arrays; Category: IC; Lead Free: Yes; Temperature: 0°C to +100°C; Temperature Range Low: 0°C; Digikey Description: IC FPGA 520 I/O 1156FCBGA

## Sheet CW341_FPGA_MGT.SchDoc: Kintex MGT Tiles
size Letter; Organization: NewAE Technology Inc.; Address1: 1083 Queen St., Suite 196; Address2: Halifax; Address3: NS; Address4: Canada B3H 0B2; DocumentNumber: .; Revision: .; SheetNumber: 5; SheetTotal: 16; SheetApproved: YES
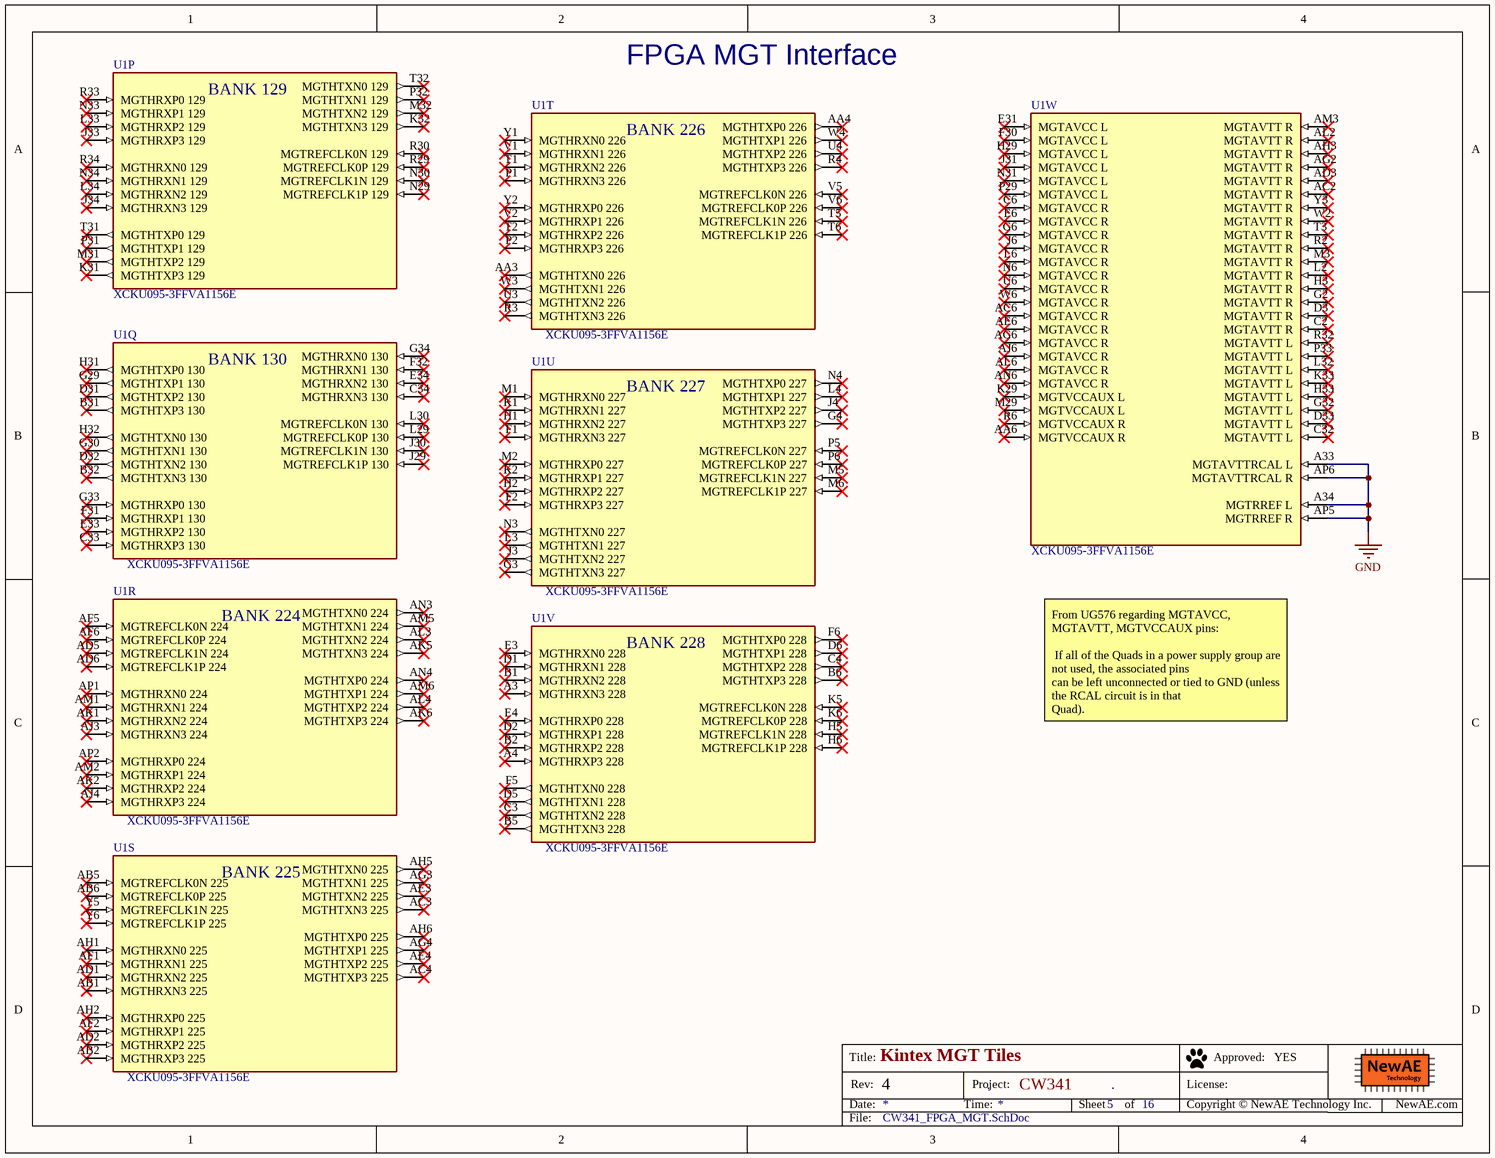
[diagram p4: CW341_FPGA_MGT.SchDoc]

### Parts
U1  XCKU095-3FFVA1156E  [FP-XCKU060-3FFVA1156E-MFG]  (parts P,Q,R,S,T,U,V,W of 23)

### Nets
GND: U1.A33(MGTAVTTRCAL_L) U1.A34(MGTRREF_L) U1.AP5(MGTRREF_R) U1.AP6(MGTAVTTRCAL_R)

Not connected (* = marked no-connect by the designer): U1 A3(MGTHRXN3_228)* A4(MGTHRXP3_228)* AA3(MGTHTXN0_226)* AA4(MGTHTXP0_226)* AA6(MGTVCCAUX_R)* AB1(MGTHRXN3_225)* AB2(MGTHRXP3_225)* AB5(MGTREFCLK0N_225)* AB6(MGTREFCLK0P_225)* AC2(MGTAVTT_R)* AC3(MGTHTXN3_225)* AC4(MGTHTXP3_225)* AC6(MGTAVCC_R)* AD1(MGTHRXN2_225)* AD2(MGTHRXP2_225)* AD3(MGTAVTT_R)* AD5(MGTREFCLK1N_224)* AD6(MGTREFCLK1P_224)* AE3(MGTHTXN2_225)* AE4(MGTHTXP2_225)* AE6(MGTAVCC_R)* AF1(MGTHRXN1_225)* AF2(MGTHRXP1_225)* AF5(MGTREFCLK0N_224)* AF6(MGTREFCLK0P_224)* AG2(MGTAVTT_R)* AG3(MGTHTXN1_225)* AG4(MGTHTXP1_225)* AG6(MGTAVCC_R)* AH1(MGTHRXN0_225)* AH2(MGTHRXP0_225)* AH3(MGTAVTT_R)* AH5(MGTHTXN0_225)* AH6(MGTHTXP0_225)* AJ3(MGTHRXN3_224)* AJ4(MGTHRXP3_224)* AJ6(MGTAVCC_R)* AK1(MGTHRXN2_224)* AK2(MGTHRXP2_224)* AK5(MGTHTXN3_224)* AK6(MGTHTXP3_224)* AL2(MGTAVTT_R)* AL3(MGTHTXN2_224)* AL4(MGTHTXP2_224)* AL6(MGTAVCC_R)* AM1(MGTHRXN1_224)* AM2(MGTHRXP1_224)* AM3(MGTAVTT_R)* AM5(MGTHTXN1_224)* AM6(MGTHTXP1_224)* AN3(MGTHTXN0_224)* AN4(MGTHTXP0_224)* AN6(MGTAVCC_R)* AP1(MGTHRXN0_224)* AP2(MGTHRXP0_224)* B1(MGTHRXN2_228)* B2(MGTHRXP2_228)* B5(MGTHTXN3_228)* B6(MGTHTXP3_228)* B31(MGTHTXP3_130)* B32(MGTHTXN3_130)* C2(MGTAVTT_R)* C3(MGTHTXN2_228)* C4(MGTHTXP2_228)* C6(MGTAVCC_R)* C32(MGTAVTT_L)* C33(MGTHRXP3_130)* C34(MGTHRXN3_130)* D1(MGTHRXN1_228)* D2(MGTHRXP1_228)* D3(MGTAVTT_R)* D5(MGTHTXN1_228)* D6(MGTHTXP1_228)* D31(MGTHTXP2_130)* D32(MGTHTXN2_130)* D33(MGTAVTT_L)* E3(MGTHRXN0_228)* E4(MGTHRXP0_228)* E6(MGTAVCC_R)* E31(MGTAVCC_L)* E33(MGTHRXP2_130)* E34(MGTHRXN2_130)* F1(MGTHRXN3_227)* F2(MGTHRXP3_227)* F5(MGTHTXN0_228)* F6(MGTHTXP0_228)* F30(MGTAVCC_L)* F31(MGTHRXP1_130)* F32(MGTHRXN1_130)* G2(MGTAVTT_R)* G3(MGTHTXN3_227)* G4(MGTHTXP3_227)* G6(MGTAVCC_R)* G29(MGTHTXP1_130)* G30(MGTHTXN1_130)* G32(MGTAVTT_L)* G33(MGTHRXP0_130)* G34(MGTHRXN0_130)* H1(MGTHRXN2_227)* H2(MGTHRXP2_227)* H3(MGTAVTT_R)* H5(MGTREFCLK1N_228)* H6(MGTREFCLK1P_228)* H29(MGTAVCC_L)* H31(MGTHTXP0_130)* H32(MGTHTXN0_130)* H33(MGTAVTT_L)* J3(MGTHTXN2_227)* J4(MGTHTXP2_227)* J6(MGTAVCC_R)* J29(MGTREFCLK1P_130)* J30(MGTREFCLK1N_130)* J31(MGTAVCC_L)* J33(MGTHRXP3_129)* J34(MGTHRXN3_129)* K1(MGTHRXN1_227)* K2(MGTHRXP1_227)* K5(MGTREFCLK0N_228)* K6(MGTREFCLK0P_228)* K29(MGTVCCAUX_L)* K31(MGTHTXP3_129)* K32(MGTHTXN3_129)* K33(MGTAVTT_L)* L2(MGTAVTT_R)* L3(MGTHTXN1_227)* L4(MGTHTXP1_227)* L6(MGTAVCC_R)* L29(MGTREFCLK0P_130)* L30(MGTREFCLK0N_130)* L32(MGTAVTT_L)* L33(MGTHRXP2_129)* L34(MGTHRXN2_129)* M1(MGTHRXN0_227)* M2(MGTHRXP0_227)* M3(MGTAVTT_R)* M5(MGTREFCLK1N_227)* M6(MGTREFCLK1P_227)* M29(MGTVCCAUX_L)* M31(MGTHTXP2_129)* M32(MGTHTXN2_129)* N3(MGTHTXN0_227)* N4(MGTHTXP0_227)* N6(MGTAVCC_R)* N29(MGTREFCLK1P_129)* N30(MGTREFCLK1N_129)* N31(MGTAVCC_L)* N33(MGTHRXP1_129)* N34(MGTHRXN1_129)* P1(MGTHRXN3_226)* P2(MGTHRXP3_226)* P5(MGTREFCLK0N_227)* P6(MGTREFCLK0P_227)* P29(MGTAVCC_L)* P31(MGTHTXP1_129)* P32(MGTHTXN1_129)* P33(MGTAVTT_L)* R2(MGTAVTT_R)* R3(MGTHTXN3_226)* R4(MGTHTXP3_226)* R6(MGTVCCAUX_R)* R29(MGTREFCLK0P_129)* R30(MGTREFCLK0N_129)* R32(MGTAVTT_L)* R33(MGTHRXP0_129)* R34(MGTHRXN0_129)* T1(MGTHRXN2_226)* T2(MGTHRXP2_226)* T3(MGTAVTT_R)* T5(MGTREFCLK1N_226)* T6(MGTREFCLK1P_226)* T31(MGTHTXP0_129)* T32(MGTHTXN0_129)* U3(MGTHTXN2_226)* U4(MGTHTXP2_226)* U6(MGTAVCC_R)* V1(MGTHRXN1_226)* V2(MGTHRXP1_226)* V5(MGTREFCLK0N_226)* V6(MGTREFCLK0P_226)* W2(MGTAVTT_R)* W3(MGTHTXN1_226)* W4(MGTHTXP1_226)* W6(MGTAVCC_R)* Y1(MGTHRXN0_226)* Y2(MGTHRXP0_226)* Y3(MGTAVTT_R)* Y5(MGTREFCLK1N_225)* Y6(MGTREFCLK1P_225)*

### Notes on the sheet
- FPGA MGT Interface
- From UG576 regarding MGTAVCC, MGTAVTT, MGTVCCAUX pins:
  If all of the Quads in a power supply group are not used, the associated pins
  can be left unconnected or tied to GND (unless the RCAL circuit is in that
  Quad).
- Title:
- Date:
- Rev:
- Time:
- Project:
- Sheet
- of
- License:
- Copyright © NewAE Technology Inc.
- Approved:
- NewAE.com
- File:
- (in symbol IC-XCKU095-1156, part P) BANK 129
- (in symbol IC-XCKU095-1156, part Q) BANK 130
- (in symbol IC-XCKU095-1156, part R) BANK 224
- (in symbol IC-XCKU095-1156, part S) BANK 225
- (in symbol IC-XCKU095-1156, part T) BANK 226
- (in symbol IC-XCKU095-1156, part U) BANK 227
- (in symbol IC-XCKU095-1156, part V) BANK 228

### Library data of the parts
U1 = IC-XCKU095-1156: as U1 on sheet CW341_FPGA_PWR; Ipc Land Pattern Name: BGA1156N100P34X34_3500X3500X342; RoHS: TRUE; Height: 3.51mm; Footprint Url: https://www.xilinx.com/support/documentation/user_guides/ug575-ultrascale-pkg-pinout.pdf; Device Class L2: Embedded Processors and Controllers; ComponentLink2URL: https://www.xilinx.com/support/documentation/data_sheets/ds890-ultrascale-overview.pdf; Temperature Range High: +100°C; Device Class L1: Integrated Circuits (ICs); Package: 0; Octopart: https://octopart.com/xcku035-3ffva1156e-xilinx-67038192?r=sp; Automotive: No; ComponentLink2Description: Datasheet; Device Class L3: FPGAs - Field Programmable Gate Arrays; Category: IC; Lead Free: Yes; Temperature: 0°C to +100°C; Temperature Range Low: 0°C; Digikey Description: IC FPGA 520 I/O 1156FCBGA

## Sheet CW341_FPGAIO_1.SchDoc: Kintex IO Banks
size Letter; Organization: NewAE Technology Inc.; Address1: 1083 Queen St., Suite 196; Address2: Halifax; Address3: NS; Address4: Canada B3H 0B2; DocumentNumber: .; Revision: .; SheetNumber: 6; SheetTotal: 16; SheetApproved: YES
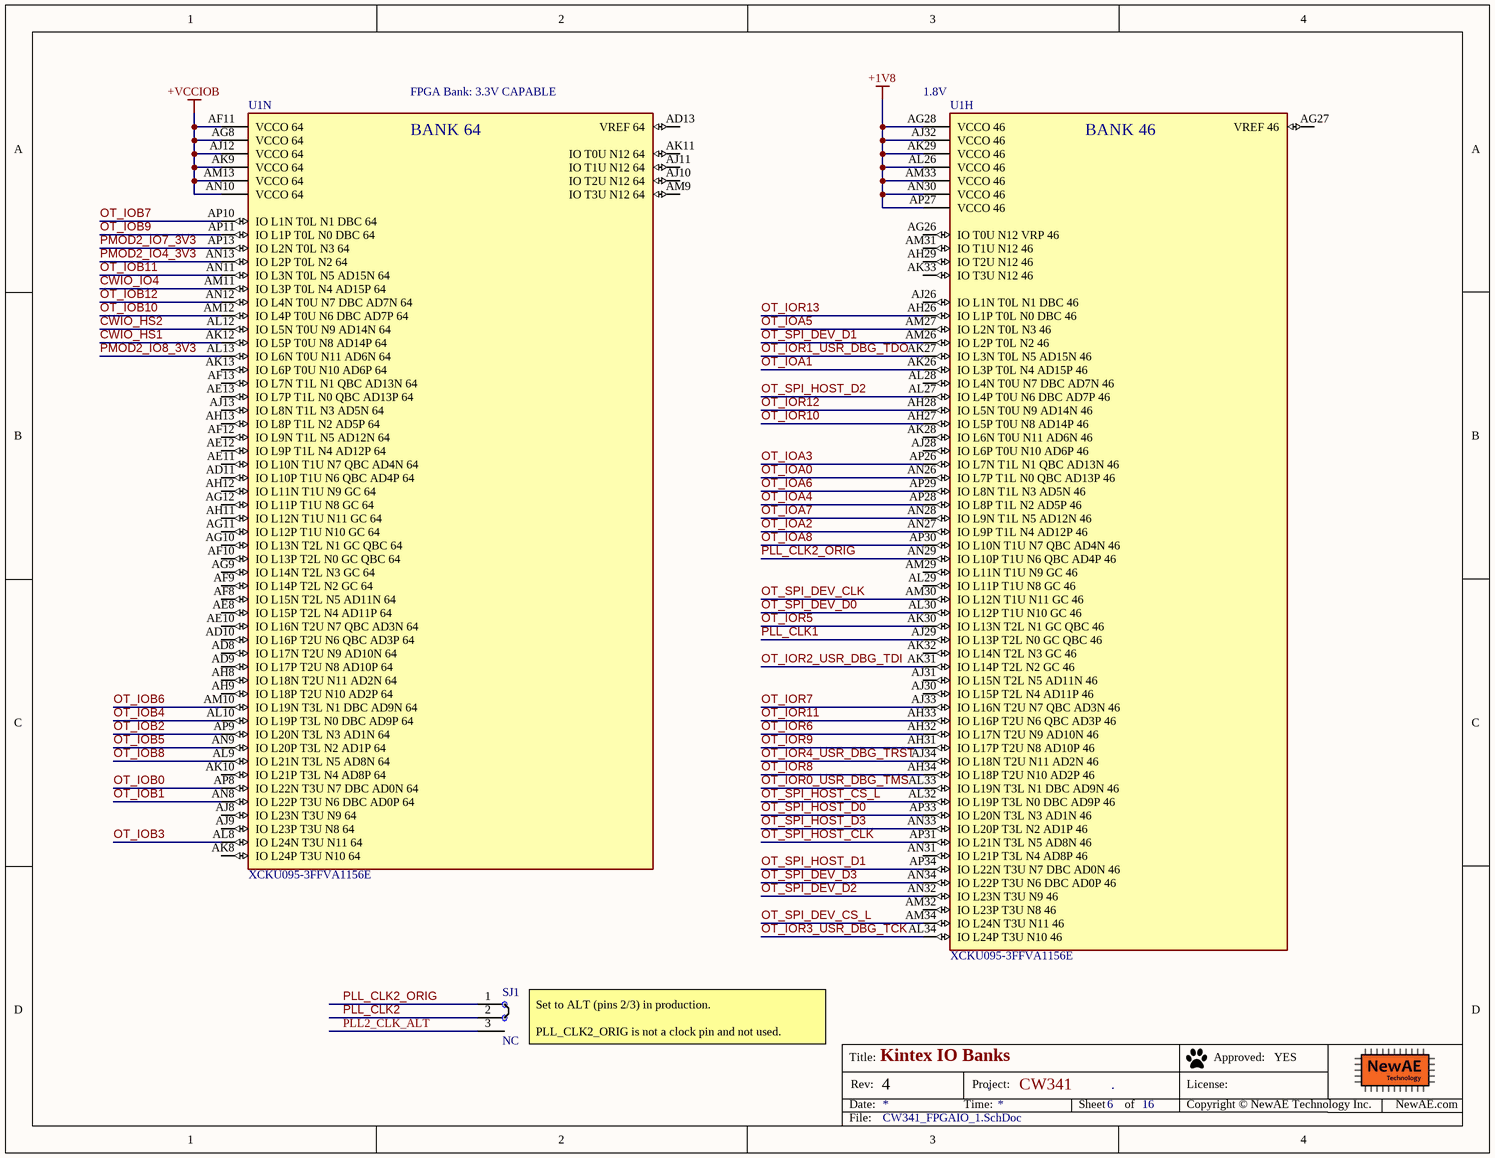
[diagram p5: CW341_FPGAIO_1.SchDoc]

### Parts
SJ1  NC  [SJ_3S_NC12]  (no BOM)
U1  XCKU095-3FFVA1156E  [FP-XCKU060-3FFVA1156E-MFG]  (parts H,N of 23)

### Nets
+1V8: U1.AG28(VCCO_46) U1.AJ32(VCCO_46) U1.AK29(VCCO_46) U1.AL26(VCCO_46) U1.AM33(VCCO_46) U1.AN30(VCCO_46) U1.AP27(VCCO_46)
+VCCIOB: U1.AF11(VCCO_64) U1.AG8(VCCO_64) U1.AJ12(VCCO_64) U1.AK9(VCCO_64) U1.AM13(VCCO_64) U1.AN10(VCCO_64)
CWIO_HS1: U1.AK12(IO_L5P_T0U_N8_AD14P_64)
CWIO_HS2: U1.AL12(IO_L5N_T0U_N9_AD14N_64)
CWIO_IO4: U1.AM11(IO_L3P_T0L_N4_AD15P_64)
OT_IOA0: U1.AN26(IO_L7P_T1L_N0_QBC_AD13P_46)
OT_IOA1: U1.AK26(IO_L3P_T0L_N4_AD15P_46)
OT_IOA2: U1.AN27(IO_L9P_T1L_N4_AD12P_46)
OT_IOA3: U1.AP26(IO_L7N_T1L_N1_QBC_AD13N_46)
OT_IOA4: U1.AP28(IO_L8P_T1L_N2_AD5P_46)
OT_IOA5: U1.AM27(IO_L2N_T0L_N3_46)
OT_IOA6: U1.AP29(IO_L8N_T1L_N3_AD5N_46)
OT_IOA7: U1.AN28(IO_L9N_T1L_N5_AD12N_46)
OT_IOA8: U1.AP30(IO_L10N_T1U_N7_QBC_AD4N_46)
OT_IOB0: U1.AP8(IO_L22N_T3U_N7_DBC_AD0N_64)
OT_IOB1: U1.AN8(IO_L22P_T3U_N6_DBC_AD0P_64)
OT_IOB2: U1.AP9(IO_L20N_T3L_N3_AD1N_64)
OT_IOB3: U1.AL8(IO_L24N_T3U_N11_64)
OT_IOB4: U1.AL10(IO_L19P_T3L_N0_DBC_AD9P_64)
OT_IOB5: U1.AN9(IO_L20P_T3L_N2_AD1P_64)
OT_IOB6: U1.AM10(IO_L19N_T3L_N1_DBC_AD9N_64)
OT_IOB7: U1.AP10(IO_L1N_T0L_N1_DBC_64)
OT_IOB8: U1.AL9(IO_L21N_T3L_N5_AD8N_64)
OT_IOB9: U1.AP11(IO_L1P_T0L_N0_DBC_64)
OT_IOB10: U1.AM12(IO_L4P_T0U_N6_DBC_AD7P_64)
OT_IOB11: U1.AN11(IO_L3N_T0L_N5_AD15N_64)
OT_IOB12: U1.AN12(IO_L4N_T0U_N7_DBC_AD7N_64)
OT_IOR0_USR_DBG_TMS: U1.AL33(IO_L19N_T3L_N1_DBC_AD9N_46)
OT_IOR1_USR_DBG_TDO: U1.AK27(IO_L3N_T0L_N5_AD15N_46)
OT_IOR2_USR_DBG_TDI: U1.AK31(IO_L14P_T2L_N2_GC_46)
OT_IOR3_USR_DBG_TCK: U1.AL34(IO_L24P_T3U_N10_46)
OT_IOR4_USR_DBG_TRST: U1.AJ34(IO_L18N_T2U_N11_AD2N_46)
OT_IOR5: U1.AK30(IO_L13N_T2L_N1_GC_QBC_46)
OT_IOR6: U1.AH32(IO_L17N_T2U_N9_AD10N_46)
OT_IOR7: U1.AJ33(IO_L16N_T2U_N7_QBC_AD3N_46)
OT_IOR8: U1.AH34(IO_L18P_T2U_N10_AD2P_46)
OT_IOR9: U1.AH31(IO_L17P_T2U_N8_AD10P_46)
OT_IOR10: U1.AH27(IO_L5P_T0U_N8_AD14P_46)
OT_IOR11: U1.AH33(IO_L16P_T2U_N6_QBC_AD3P_46)
OT_IOR12: U1.AH28(IO_L5N_T0U_N9_AD14N_46)
OT_IOR13: U1.AH26(IO_L1P_T0L_N0_DBC_46)
OT_SPI_DEV_CLK: U1.AM30(IO_L12N_T1U_N11_GC_46)
OT_SPI_DEV_CS_L: U1.AM34(IO_L24N_T3U_N11_46)
OT_SPI_DEV_D0: U1.AL30(IO_L12P_T1U_N10_GC_46)
OT_SPI_DEV_D1: U1.AM26(IO_L2P_T0L_N2_46)
OT_SPI_DEV_D2: U1.AN32(IO_L23N_T3U_N9_46)
OT_SPI_DEV_D3: U1.AN34(IO_L22P_T3U_N6_DBC_AD0P_46)
OT_SPI_HOST_CLK: U1.AP31(IO_L21N_T3L_N5_AD8N_46)
OT_SPI_HOST_CS_L: U1.AL32(IO_L19P_T3L_N0_DBC_AD9P_46)
OT_SPI_HOST_D0: U1.AP33(IO_L20N_T3L_N3_AD1N_46)
OT_SPI_HOST_D1: U1.AP34(IO_L22N_T3U_N7_DBC_AD0N_46)
OT_SPI_HOST_D2: U1.AL27(IO_L4P_T0U_N6_DBC_AD7P_46)
OT_SPI_HOST_D3: U1.AN33(IO_L20P_T3L_N2_AD1P_46)
PLL2_CLK_ALT: SJ1.3
PLL_CLK1: U1.AJ29(IO_L13P_T2L_N0_GC_QBC_46)
PLL_CLK2: SJ1.2
PLL_CLK2_ORIG: SJ1.1 U1.AN29(IO_L10P_T1U_N6_QBC_AD4P_46)
PMOD2_IO4_3V3: U1.AN13(IO_L2P_T0L_N2_64)
PMOD2_IO7_3V3: U1.AP13(IO_L2N_T0L_N3_64)
PMOD2_IO8_3V3: U1.AL13(IO_L6N_T0U_N11_AD6N_64)

Not connected (* = marked no-connect by the designer): U1 AD8(IO_L17N_T2U_N9_AD10N_64) AD9(IO_L17P_T2U_N8_AD10P_64) AD10(IO_L16P_T2U_N6_QBC_AD3P_64) AD11(IO_L10P_T1U_N6_QBC_AD4P_64) AD13(VREF_64) AE8(IO_L15P_T2L_N4_AD11P_64) AE10(IO_L16N_T2U_N7_QBC_AD3N_64) AE11(IO_L10N_T1U_N7_QBC_AD4N_64) AE12(IO_L9P_T1L_N4_AD12P_64) AE13(IO_L7P_T1L_N0_QBC_AD13P_64) AF8(IO_L15N_T2L_N5_AD11N_64) AF9(IO_L14P_T2L_N2_GC_64) AF10(IO_L13P_T2L_N0_GC_QBC_64) AF12(IO_L9N_T1L_N5_AD12N_64) AF13(IO_L7N_T1L_N1_QBC_AD13N_64) AG9(IO_L14N_T2L_N3_GC_64) AG10(IO_L13N_T2L_N1_GC_QBC_64) AG11(IO_L12P_T1U_N10_GC_64) AG12(IO_L11P_T1U_N8_GC_64) AG26(IO_T0U_N12_VRP_46) AG27(VREF_46) AH8(IO_L18N_T2U_N11_AD2N_64) AH9(IO_L18P_T2U_N10_AD2P_64) AH11(IO_L12N_T1U_N11_GC_64) AH12(IO_L11N_T1U_N9_GC_64) AH13(IO_L8P_T1L_N2_AD5P_64) AH29(IO_T2U_N12_46) AJ8(IO_L23N_T3U_N9_64) AJ9(IO_L23P_T3U_N8_64) AJ10(IO_T2U_N12_64) AJ11(IO_T1U_N12_64) AJ13(IO_L8N_T1L_N3_AD5N_64) AJ26(IO_L1N_T0L_N1_DBC_46) AJ28(IO_L6P_T0U_N10_AD6P_46) AJ30(IO_L15P_T2L_N4_AD11P_46) AJ31(IO_L15N_T2L_N5_AD11N_46) AK8(IO_L24P_T3U_N10_64) AK10(IO_L21P_T3L_N4_AD8P_64) AK11(IO_T0U_N12_64) AK13(IO_L6P_T0U_N10_AD6P_64) AK28(IO_L6N_T0U_N11_AD6N_46) AK32(IO_L14N_T2L_N3_GC_46) AK33(IO_T3U_N12_46) AL28(IO_L4N_T0U_N7_DBC_AD7N_46) AL29(IO_L11P_T1U_N8_GC_46) AM9(IO_T3U_N12_64) AM29(IO_L11N_T1U_N9_GC_46) AM31(IO_T1U_N12_46) AM32(IO_L23P_T3U_N8_46) AN31(IO_L21P_T3L_N4_AD8P_46)

### Notes on the sheet
- (near U1) FPGA Bank: 3.3V CAPABLE
- (near U1) 1.8V
- (near SJ1) Set to ALT (pins 2/3) in production.
  PLL_CLK2_ORIG is not a clock pin and not used.
- Title:
- Date:
- Rev:
- Time:
- Project:
- Sheet
- of
- License:
- Copyright © NewAE Technology Inc.
- Approved:
- NewAE.com
- File:
- (in symbol IC-XCKU095-1156, part H) BANK 46
- (in symbol IC-XCKU095-1156, part N) BANK 64

### Library data of the parts
SJ1 = SJ_3S_12JMP: Solder Jumper, NC; Component Group: PCB Feature; Part Number: SJ_3S_12JMP; Pin Count: 3; Mounting Technology: COPPER; Component Type: Standard (No BOM)
U1 = IC-XCKU095-1156: as U1 on sheet CW341_FPGA_PWR; Ipc Land Pattern Name: BGA1156N100P34X34_3500X3500X342; RoHS: TRUE; Height: 3.51mm; Footprint Url: https://www.xilinx.com/support/documentation/user_guides/ug575-ultrascale-pkg-pinout.pdf; Device Class L2: Embedded Processors and Controllers; ComponentLink2URL: https://www.xilinx.com/support/documentation/data_sheets/ds890-ultrascale-overview.pdf; Temperature Range High: +100°C; Device Class L1: Integrated Circuits (ICs); Package: 0; Octopart: https://octopart.com/xcku035-3ffva1156e-xilinx-67038192?r=sp; Automotive: No; ComponentLink2Description: Datasheet; Device Class L3: FPGAs - Field Programmable Gate Arrays; Category: IC; Lead Free: Yes; Temperature: 0°C to +100°C; Temperature Range Low: 0°C; Digikey Description: IC FPGA 520 I/O 1156FCBGA

## Sheet CW341_FPGAIO_2.SchDoc: Kintex IO Banks
size Letter; Organization: NewAE Technology Inc.; Address1: 1083 Queen St., Suite 196; Address2: Halifax; Address3: NS; Address4: Canada B3H 0B2; DocumentNumber: .; Revision: .; SheetNumber: 7; SheetTotal: 16; SheetApproved: YES
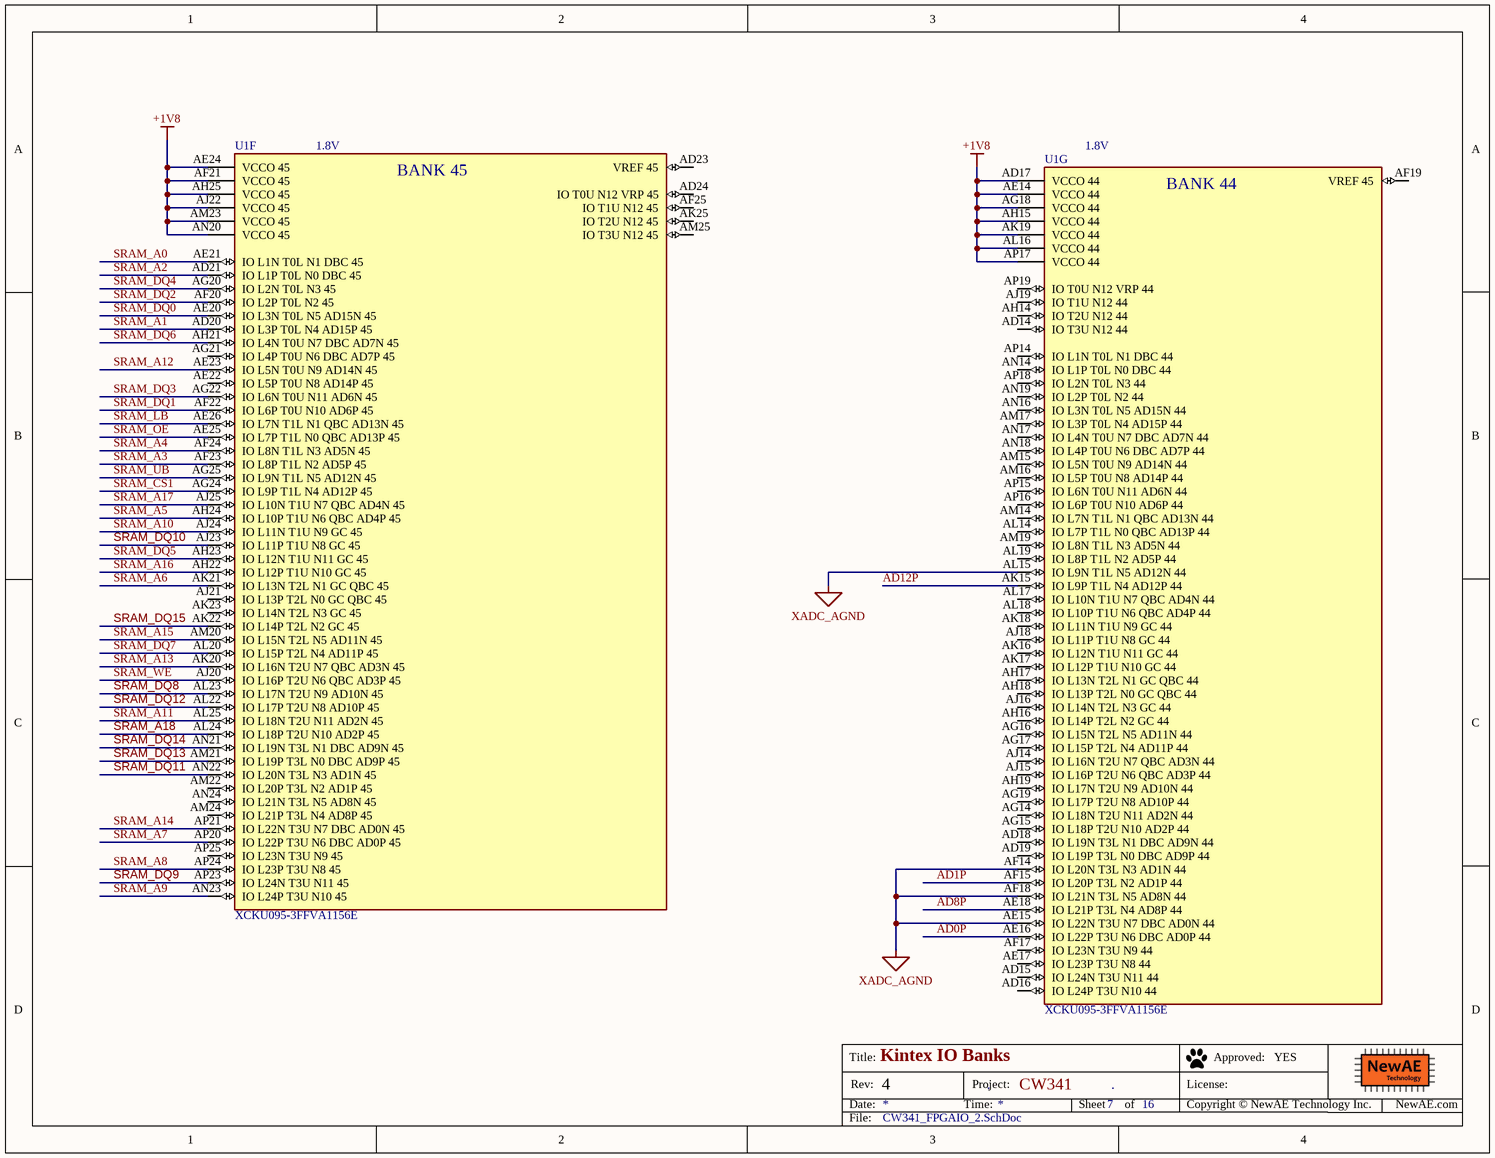
[diagram p6: CW341_FPGAIO_2.SchDoc]

### Parts
U1  XCKU095-3FFVA1156E  [FP-XCKU060-3FFVA1156E-MFG]  (parts F,G of 23)

### Nets
+1V8: U1.AD17(VCCO_44) U1.AE14(VCCO_44) U1.AE24(VCCO_45) U1.AF21(VCCO_45) U1.AG18(VCCO_44) U1.AH15(VCCO_44) U1.AH25(VCCO_45) U1.AJ22(VCCO_45) U1.AK19(VCCO_44) U1.AL16(VCCO_44) U1.AM23(VCCO_45) U1.AN20(VCCO_45) U1.AP17(VCCO_44)
XADC_AGND: U1.AE15(IO_L22N_T3U_N7_DBC_AD0N_44) U1.AF14(IO_L20N_T3L_N3_AD1N_44) U1.AF18(IO_L21N_T3L_N5_AD8N_44) U1.AL15(IO_L9N_T1L_N5_AD12N_44)  [project net XADC_VREF_N]
AD0P: U1.AE16(IO_L22P_T3U_N6_DBC_AD0P_44)
AD1P: U1.AF15(IO_L20P_T3L_N2_AD1P_44)
AD8P: U1.AE18(IO_L21P_T3L_N4_AD8P_44)
AD12P: U1.AK15(IO_L9P_T1L_N4_AD12P_44)
SRAM_A0: U1.AE21(IO_L1N_T0L_N1_DBC_45)
SRAM_A1: U1.AD20(IO_L3P_T0L_N4_AD15P_45)
SRAM_A2: U1.AD21(IO_L1P_T0L_N0_DBC_45)
SRAM_A3: U1.AF23(IO_L8P_T1L_N2_AD5P_45)
SRAM_A4: U1.AF24(IO_L8N_T1L_N3_AD5N_45)
SRAM_A5: U1.AH24(IO_L10P_T1U_N6_QBC_AD4P_45)
SRAM_A6: U1.AK21(IO_L13N_T2L_N1_GC_QBC_45)
SRAM_A7: U1.AP20(IO_L22P_T3U_N6_DBC_AD0P_45)
SRAM_A8: U1.AP24(IO_L23P_T3U_N8_45)
SRAM_A9: U1.AN23(IO_L24P_T3U_N10_45)
SRAM_A10: U1.AJ24(IO_L11N_T1U_N9_GC_45)
SRAM_A11: U1.AL25(IO_L18N_T2U_N11_AD2N_45)
SRAM_A12: U1.AE23(IO_L5N_T0U_N9_AD14N_45)
SRAM_A13: U1.AK20(IO_L16N_T2U_N7_QBC_AD3N_45)
SRAM_A14: U1.AP21(IO_L22N_T3U_N7_DBC_AD0N_45)
SRAM_A15: U1.AM20(IO_L15N_T2L_N5_AD11N_45)
SRAM_A16: U1.AH22(IO_L12P_T1U_N10_GC_45)
SRAM_A17: U1.AJ25(IO_L10N_T1U_N7_QBC_AD4N_45)
SRAM_A18: U1.AL24(IO_L18P_T2U_N10_AD2P_45)
SRAM_~{CS1}: U1.AG24(IO_L9P_T1L_N4_AD12P_45)
SRAM_DQ0: U1.AE20(IO_L3N_T0L_N5_AD15N_45)
SRAM_DQ1: U1.AF22(IO_L6P_T0U_N10_AD6P_45)
SRAM_DQ2: U1.AF20(IO_L2P_T0L_N2_45)
SRAM_DQ3: U1.AG22(IO_L6N_T0U_N11_AD6N_45)
SRAM_DQ4: U1.AG20(IO_L2N_T0L_N3_45)
SRAM_DQ5: U1.AH23(IO_L12N_T1U_N11_GC_45)
SRAM_DQ6: U1.AH21(IO_L4N_T0U_N7_DBC_AD7N_45)
SRAM_DQ7: U1.AL20(IO_L15P_T2L_N4_AD11P_45)
SRAM_DQ8: U1.AL23(IO_L17N_T2U_N9_AD10N_45)
SRAM_DQ9: U1.AP23(IO_L24N_T3U_N11_45)
SRAM_DQ10: U1.AJ23(IO_L11P_T1U_N8_GC_45)
SRAM_DQ11: U1.AN22(IO_L20N_T3L_N3_AD1N_45)
SRAM_DQ12: U1.AL22(IO_L17P_T2U_N8_AD10P_45)
SRAM_DQ13: U1.AM21(IO_L19P_T3L_N0_DBC_AD9P_45)
SRAM_DQ14: U1.AN21(IO_L19N_T3L_N1_DBC_AD9N_45)
SRAM_DQ15: U1.AK22(IO_L14P_T2L_N2_GC_45)
SRAM_~{LB}: U1.AE26(IO_L7N_T1L_N1_QBC_AD13N_45)
SRAM_~{OE}: U1.AE25(IO_L7P_T1L_N0_QBC_AD13P_45)
SRAM_~{UB}: U1.AG25(IO_L9N_T1L_N5_AD12N_45)
SRAM_~{WE}: U1.AJ20(IO_L16P_T2U_N6_QBC_AD3P_45)

Not connected (* = marked no-connect by the designer): U1 AD14(IO_T3U_N12_44) AD15(IO_L24N_T3U_N11_44) AD16(IO_L24P_T3U_N10_44) AD18(IO_L19N_T3L_N1_DBC_AD9N_44) AD19(IO_L19P_T3L_N0_DBC_AD9P_44) AD23(VREF_45) AD24(IO_T0U_N12_VRP_45) AE17(IO_L23P_T3U_N8_44) AE22(IO_L5P_T0U_N8_AD14P_45) AF17(IO_L23N_T3U_N9_44) AF19(VREF_45) AF25(IO_T1U_N12_45) AG14(IO_L18N_T2U_N11_AD2N_44) AG15(IO_L18P_T2U_N10_AD2P_44) AG16(IO_L15N_T2L_N5_AD11N_44) AG17(IO_L15P_T2L_N4_AD11P_44) AG19(IO_L17P_T2U_N8_AD10P_44) AG21(IO_L4P_T0U_N6_DBC_AD7P_45) AH14(IO_T2U_N12_44) AH16(IO_L14P_T2L_N2_GC_44) AH17(IO_L13N_T2L_N1_GC_QBC_44) AH18(IO_L13P_T2L_N0_GC_QBC_44) AH19(IO_L17N_T2U_N9_AD10N_44) AJ14(IO_L16N_T2U_N7_QBC_AD3N_44) AJ15(IO_L16P_T2U_N6_QBC_AD3P_44) AJ16(IO_L14N_T2L_N3_GC_44) AJ18(IO_L11P_T1U_N8_GC_44) AJ19(IO_T1U_N12_44) AJ21(IO_L13P_T2L_N0_GC_QBC_45) AK16(IO_L12N_T1U_N11_GC_44) AK17(IO_L12P_T1U_N10_GC_44) AK18(IO_L11N_T1U_N9_GC_44) AK23(IO_L14N_T2L_N3_GC_45) AK25(IO_T2U_N12_45) AL14(IO_L7P_T1L_N0_QBC_AD13P_44) AL17(IO_L10N_T1U_N7_QBC_AD4N_44) AL18(IO_L10P_T1U_N6_QBC_AD4P_44) AL19(IO_L8P_T1L_N2_AD5P_44) AM14(IO_L7N_T1L_N1_QBC_AD13N_44) AM15(IO_L5N_T0U_N9_AD14N_44) AM16(IO_L5P_T0U_N8_AD14P_44) AM17(IO_L3P_T0L_N4_AD15P_44) AM19(IO_L8N_T1L_N3_AD5N_44) AM22(IO_L20P_T3L_N2_AD1P_45) AM24(IO_L21P_T3L_N4_AD8P_45) AM25(IO_T3U_N12_45) AN14(IO_L1P_T0L_N0_DBC_44) AN16(IO_L3N_T0L_N5_AD15N_44) AN17(IO_L4N_T0U_N7_DBC_AD7N_44) AN18(IO_L4P_T0U_N6_DBC_AD7P_44) AN19(IO_L2P_T0L_N2_44) AN24(IO_L21N_T3L_N5_AD8N_45) AP14(IO_L1N_T0L_N1_DBC_44) AP15(IO_L6N_T0U_N11_AD6N_44) AP16(IO_L6P_T0U_N10_AD6P_44) AP18(IO_L2N_T0L_N3_44) AP19(IO_T0U_N12_VRP_44) AP25(IO_L23N_T3U_N9_45)

### Notes on the sheet
- (near U1) 1.8V
- Title:
- Date:
- Rev:
- Time:
- Project:
- Sheet
- of
- License:
- Copyright © NewAE Technology Inc.
- Approved:
- NewAE.com
- File:
- (in symbol IC-XCKU095-1156, part F) BANK 45
- (in symbol IC-XCKU095-1156, part G) BANK 44

### Library data of the parts
U1 = IC-XCKU095-1156: as U1 on sheet CW341_FPGA_PWR; Ipc Land Pattern Name: BGA1156N100P34X34_3500X3500X342; RoHS: TRUE; Height: 3.51mm; Footprint Url: https://www.xilinx.com/support/documentation/user_guides/ug575-ultrascale-pkg-pinout.pdf; Device Class L2: Embedded Processors and Controllers; ComponentLink2URL: https://www.xilinx.com/support/documentation/data_sheets/ds890-ultrascale-overview.pdf; Temperature Range High: +100°C; Device Class L1: Integrated Circuits (ICs); Package: 0; Octopart: https://octopart.com/xcku035-3ffva1156e-xilinx-67038192?r=sp; Automotive: No; ComponentLink2Description: Datasheet; Device Class L3: FPGAs - Field Programmable Gate Arrays; Category: IC; Lead Free: Yes; Temperature: 0°C to +100°C; Temperature Range Low: 0°C; Digikey Description: IC FPGA 520 I/O 1156FCBGA

## Sheet CW341_FPGAIO_3.SchDoc: Kintex IO Banks
size Letter; Organization: NewAE Technology Inc.; Address1: 1083 Queen St., Suite 196; Address2: Halifax; Address3: NS; Address4: Canada B3H 0B2; DocumentNumber: .; Revision: .; SheetNumber: 8; SheetTotal: 16; SheetApproved: No
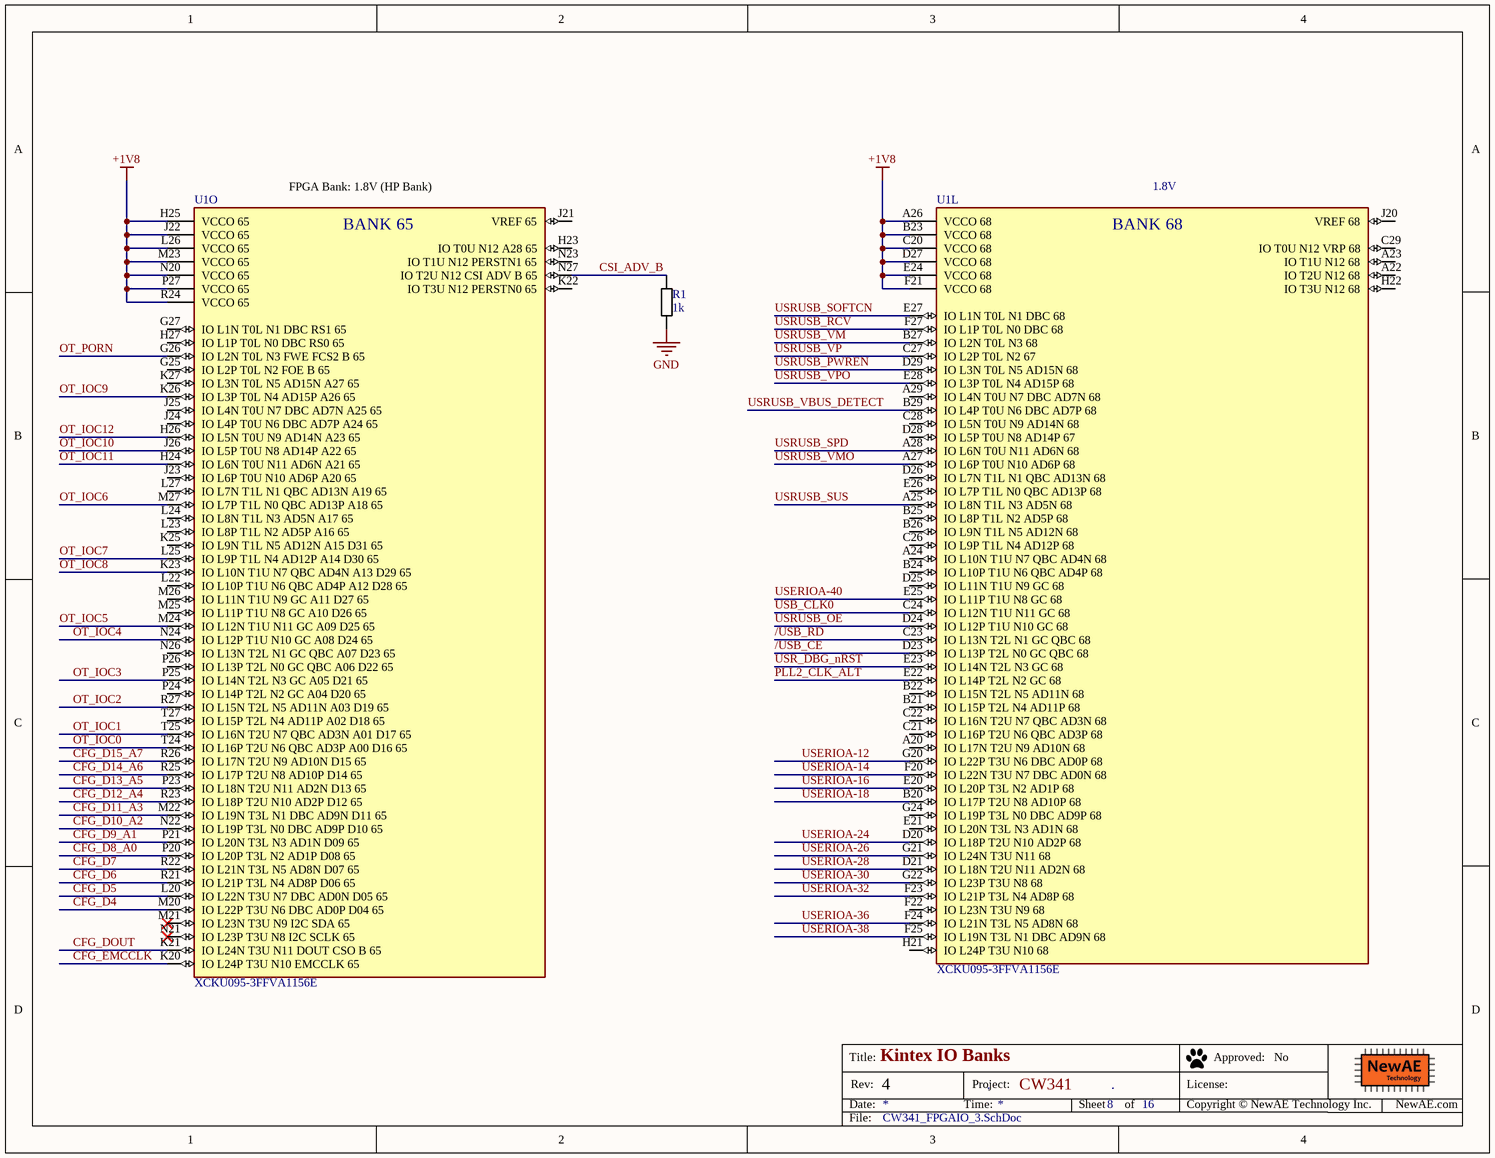
[diagram p7: CW341_FPGAIO_3.SchDoc]

### Parts
R1  1k  [RESC1005X40N]
U1  XCKU095-3FFVA1156E  [FP-XCKU060-3FFVA1156E-MFG]  (parts L,O of 23)

### Nets
+1V8: U1.A26(VCCO_68) U1.B23(VCCO_68) U1.C20(VCCO_68) U1.D27(VCCO_68) U1.E24(VCCO_68) U1.F21(VCCO_68) U1.H25(VCCO_65) U1.J22(VCCO_65) U1.L26(VCCO_65) U1.M23(VCCO_65) U1.N20(VCCO_65) U1.P27(VCCO_65) U1.R24(VCCO_65)
GND: R1.2
/USB_CE: U1.D23(IO_L13P_T2L_N0_GC_QBC_68)
/USB_RD: U1.C23(IO_L13N_T2L_N1_GC_QBC_68)
CFG_D4: U1.M20(IO_L22P_T3U_N6_DBC_AD0P_D04_65)
CFG_D5: U1.L20(IO_L22N_T3U_N7_DBC_AD0N_D05_65)
CFG_D6: U1.R21(IO_L21P_T3L_N4_AD8P_D06_65)
CFG_D7: U1.R22(IO_L21N_T3L_N5_AD8N_D07_65)
CFG_D8_A0: U1.P20(IO_L20P_T3L_N2_AD1P_D08_65)
CFG_D9_A1: U1.P21(IO_L20N_T3L_N3_AD1N_D09_65)
CFG_D10_A2: U1.N22(IO_L19P_T3L_N0_DBC_AD9P_D10_65)
CFG_D11_A3: U1.M22(IO_L19N_T3L_N1_DBC_AD9N_D11_65)
CFG_D12_A4: U1.R23(IO_L18P_T2U_N10_AD2P_D12_65)
CFG_D13_A5: U1.P23(IO_L18N_T2U_N11_AD2N_D13_65)
CFG_D14_A6: U1.R25(IO_L17P_T2U_N8_AD10P_D14_65)
CFG_D15_A7: U1.R26(IO_L17N_T2U_N9_AD10N_D15_65)
CFG_DOUT: U1.K21(IO_L24N_T3U_N11_DOUT_CSO_B_65)
CFG_EMCCLK: U1.K20(IO_L24P_T3U_N10_EMCCLK_65)
CSI_ADV_B: R1.1 U1.N27(IO_T2U_N12_CSI_ADV_B_65)
OT_IOC0: U1.T24(IO_L16P_T2U_N6_QBC_AD3P_A00_D16_65)
OT_IOC1: U1.T25(IO_L16N_T2U_N7_QBC_AD3N_A01_D17_65)
OT_IOC2: U1.R27(IO_L15N_T2L_N5_AD11N_A03_D19_65)
OT_IOC3: U1.P25(IO_L14N_T2L_N3_GC_A05_D21_65)
OT_IOC4: U1.N24(IO_L12P_T1U_N10_GC_A08_D24_65)
OT_IOC5: U1.M24(IO_L12N_T1U_N11_GC_A09_D25_65)
OT_IOC6: U1.M27(IO_L7P_T1L_N0_QBC_AD13P_A18_65)
OT_IOC7: U1.L25(IO_L9P_T1L_N4_AD12P_A14_D30_65)
OT_IOC8: U1.K23(IO_L10N_T1U_N7_QBC_AD4N_A13_D29_65)
OT_IOC9: U1.K26(IO_L3P_T0L_N4_AD15P_A26_65)
OT_IOC10: U1.J26(IO_L5P_T0U_N8_AD14P_A22_65)
OT_IOC11: U1.H24(IO_L6N_T0U_N11_AD6N_A21_65)
OT_IOC12: U1.H26(IO_L5N_T0U_N9_AD14N_A23_65)
OT_PORN: U1.G26(IO_L2N_T0L_N3_FWE_FCS2_B_65)
PLL2_CLK_ALT: U1.E22(IO_L14P_T2L_N2_GC_68)
USB_CLK0: U1.C24(IO_L12N_T1U_N11_GC_68)
USERIOA-12: U1.G20(IO_L22P_T3U_N6_DBC_AD0P_68)
USERIOA-14: U1.F20(IO_L22N_T3U_N7_DBC_AD0N_68)
USERIOA-16: U1.E20(IO_L20P_T3L_N2_AD1P_68)
USERIOA-18: U1.B20(IO_L17P_T2U_N8_AD10P_68)
USERIOA-24: U1.D20(IO_L18P_T2U_N10_AD2P_68)
USERIOA-26: U1.G21(IO_L24N_T3U_N11_68)
USERIOA-28: U1.D21(IO_L18N_T2U_N11_AD2N_68)
USERIOA-30: U1.G22(IO_L23P_T3U_N8_68)
USERIOA-32: U1.F23(IO_L21P_T3L_N4_AD8P_68)
USERIOA-36: U1.F24(IO_L21N_T3L_N5_AD8N_68)
USERIOA-38: U1.F25(IO_L19N_T3L_N1_DBC_AD9N_68)
USERIOA-40: U1.E25(IO_L11P_T1U_N8_GC_68)
USR_DBG_nRST: U1.E23(IO_L14N_T2L_N3_GC_68)
USRUSB_OE: U1.D24(IO_L12P_T1U_N10_GC_68)
USRUSB_PWREN: U1.D29(IO_L3N_T0L_N5_AD15N_68)
USRUSB_RCV: U1.F27(IO_L1P_T0L_N0_DBC_68)
USRUSB_SOFTCN: U1.E27(IO_L1N_T0L_N1_DBC_68)
USRUSB_SPD: U1.A28(IO_L6N_T0U_N11_AD6N_68)
USRUSB_SUS: U1.A25(IO_L8N_T1L_N3_AD5N_68)
USRUSB_VBUS_DETECT: U1.B29(IO_L4P_T0U_N6_DBC_AD7P_68)
USRUSB_VM: U1.B27(IO_L2N_T0L_N3_68)
USRUSB_VMO: U1.A27(IO_L6P_T0U_N10_AD6P_68)
USRUSB_VP: U1.C27(IO_L2P_T0L_N2_67)
USRUSB_VPO: U1.E28(IO_L3P_T0L_N4_AD15P_68)

Not connected (* = marked no-connect by the designer): U1 A20(IO_L17N_T2U_N9_AD10N_68) A22(IO_T2U_N12_68) A23(IO_T1U_N12_68) A24(IO_L10N_T1U_N7_QBC_AD4N_68) A29(IO_L4N_T0U_N7_DBC_AD7N_68) B21(IO_L15P_T2L_N4_AD11P_68) B22(IO_L15N_T2L_N5_AD11N_68) B24(IO_L10P_T1U_N6_QBC_AD4P_68) B25(IO_L8P_T1L_N2_AD5P_68) B26(IO_L9N_T1L_N5_AD12N_68) C21(IO_L16P_T2U_N6_QBC_AD3P_68) C22(IO_L16N_T2U_N7_QBC_AD3N_68) C26(IO_L9P_T1L_N4_AD12P_68) C28(IO_L5N_T0U_N9_AD14N_68) C29(IO_T0U_N12_VRP_68) D25(IO_L11N_T1U_N9_GC_68) D26(IO_L7N_T1L_N1_QBC_AD13N_68) D28(IO_L5P_T0U_N8_AD14P_67) E21(IO_L20N_T3L_N3_AD1N_68) E26(IO_L7P_T1L_N0_QBC_AD13P_68) F22(IO_L23N_T3U_N9_68) G24(IO_L19P_T3L_N0_DBC_AD9P_68) G25(IO_L2P_T0L_N2_FOE_B_65) G27(IO_L1N_T0L_N1_DBC_RS1_65) H21(IO_L24P_T3U_N10_68) H22(IO_T3U_N12_68) H23(IO_T0U_N12_A28_65) H27(IO_L1P_T0L_N0_DBC_RS0_65) J20(VREF_68) J21(VREF_65) J23(IO_L6P_T0U_N10_AD6P_A20_65) J24(IO_L4P_T0U_N6_DBC_AD7P_A24_65) J25(IO_L4N_T0U_N7_DBC_AD7N_A25_65) K22(IO_T3U_N12_PERSTN0_65) K25(IO_L9N_T1L_N5_AD12N_A15_D31_65) K27(IO_L3N_T0L_N5_AD15N_A27_65) L22(IO_L10P_T1U_N6_QBC_AD4P_A12_D28_65) L23(IO_L8P_T1L_N2_AD5P_A16_65) L24(IO_L8N_T1L_N3_AD5N_A17_65) L27(IO_L7N_T1L_N1_QBC_AD13N_A19_65) M21(IO_L23N_T3U_N9_I2C_SDA_65)* M25(IO_L11P_T1U_N8_GC_A10_D26_65) M26(IO_L11N_T1U_N9_GC_A11_D27_65) N21(IO_L23P_T3U_N8_I2C_SCLK_65)* N23(IO_T1U_N12_PERSTN1_65) N26(IO_L13N_T2L_N1_GC_QBC_A07_D23_65) P24(IO_L14P_T2L_N2_GC_A04_D20_65) P26(IO_L13P_T2L_N0_GC_QBC_A06_D22_65) T27(IO_L15P_T2L_N4_AD11P_A02_D18_65)

### Notes on the sheet
- (near U1) FPGA Bank: 1.8V (HP Bank)
- (near U1) 1.8V
- Title:
- Date:
- Rev:
- Time:
- Project:
- Sheet
- of
- License:
- Copyright © NewAE Technology Inc.
- Approved:
- NewAE.com
- File:
- (in symbol IC-XCKU095-1156, part L) BANK 68
- (in symbol IC-XCKU095-1156, part O) BANK 65

### Library data of the parts
R1 = RCHIP-1K-0402: as R5 on sheet CW341_FPGA_CFG; Part Number: RCHIP-1K-0402; Footprint: 0402; Pin Count: 2; Supplier 1: Digi-Key; Supplier Part Number 1: 311-1.00KLRCT-ND; Value: 1k; Tolerance: 1%; Mounting Technology: SMT; Temperature Range: -55C to 155C; Component Kind: Standard; Component Type: Standard
U1 = IC-XCKU095-1156: as U1 on sheet CW341_FPGA_PWR; Ipc Land Pattern Name: BGA1156N100P34X34_3500X3500X342; RoHS: TRUE; Height: 3.51mm; Footprint Url: https://www.xilinx.com/support/documentation/user_guides/ug575-ultrascale-pkg-pinout.pdf; Device Class L2: Embedded Processors and Controllers; ComponentLink2URL: https://www.xilinx.com/support/documentation/data_sheets/ds890-ultrascale-overview.pdf; Temperature Range High: +100°C; Device Class L1: Integrated Circuits (ICs); Package: 0; Octopart: https://octopart.com/xcku035-3ffva1156e-xilinx-67038192?r=sp; Automotive: No; ComponentLink2Description: Datasheet; Device Class L3: FPGAs - Field Programmable Gate Arrays; Category: IC; Lead Free: Yes; Temperature: 0°C to +100°C; Temperature Range Low: 0°C; Digikey Description: IC FPGA 520 I/O 1156FCBGA

## Sheet CW341_FPGAIO_4.SchDoc: Kintex IO Banks
size Letter; Organization: NewAE Technology Inc.; Address1: 1083 Queen St., Suite 196; Address2: Halifax; Address3: NS; Address4: Canada B3H 0B2; SheetNumber: 9; SheetTotal: 16; SheetApproved: YES
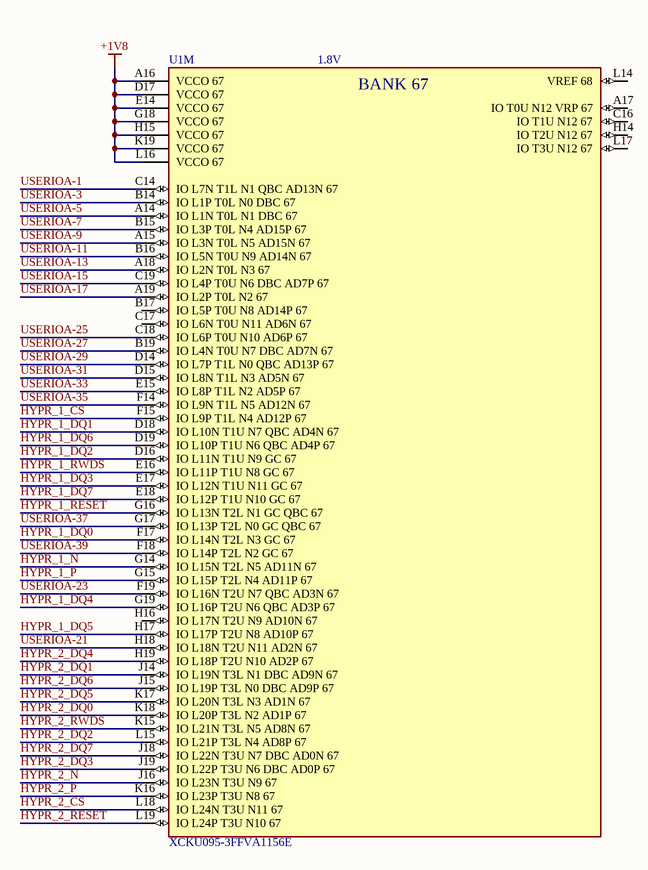
[diagram p8: CW341_FPGAIO_4.SchDoc]

### Parts
U1  XCKU095-3FFVA1156E  [FP-XCKU060-3FFVA1156E-MFG]  (part M of 23)

### Nets
+1V8: U1.A16(VCCO_67) U1.D17(VCCO_67) U1.E14(VCCO_67) U1.G18(VCCO_67) U1.H15(VCCO_67) U1.K19(VCCO_67) U1.L16(VCCO_67)
HYPR_1_~{CS}: U1.F15(IO_L9P_T1L_N4_AD12P_67)
HYPR_1_DQ0: U1.F17(IO_L14N_T2L_N3_GC_67)
HYPR_1_DQ1: U1.D18(IO_L10N_T1U_N7_QBC_AD4N_67)
HYPR_1_DQ2: U1.D16(IO_L11N_T1U_N9_GC_67)
HYPR_1_DQ3: U1.E17(IO_L12N_T1U_N11_GC_67)
HYPR_1_DQ4: U1.G19(IO_L16P_T2U_N6_QBC_AD3P_67)
HYPR_1_DQ5: U1.H17(IO_L17P_T2U_N8_AD10P_67)
HYPR_1_DQ6: U1.D19(IO_L10P_T1U_N6_QBC_AD4P_67)
HYPR_1_DQ7: U1.E18(IO_L12P_T1U_N10_GC_67)
HYPR_1_N: U1.G14(IO_L15N_T2L_N5_AD11N_67)
HYPR_1_P: U1.G15(IO_L15P_T2L_N4_AD11P_67)
HYPR_1_~{RESET}: U1.G16(IO_L13N_T2L_N1_GC_QBC_67)
HYPR_1_RWDS: U1.E16(IO_L11P_T1U_N8_GC_67)
HYPR_2_~{CS}: U1.L18(IO_L24N_T3U_N11_67)
HYPR_2_DQ0: U1.K18(IO_L20P_T3L_N2_AD1P_67)
HYPR_2_DQ1: U1.J14(IO_L19N_T3L_N1_DBC_AD9N_67)
HYPR_2_DQ2: U1.L15(IO_L21P_T3L_N4_AD8P_67)
HYPR_2_DQ3: U1.J19(IO_L22P_T3U_N6_DBC_AD0P_67)
HYPR_2_DQ4: U1.H19(IO_L18P_T2U_N10_AD2P_67)
HYPR_2_DQ5: U1.K17(IO_L20N_T3L_N3_AD1N_67)
HYPR_2_DQ6: U1.J15(IO_L19P_T3L_N0_DBC_AD9P_67)
HYPR_2_DQ7: U1.J18(IO_L22N_T3U_N7_DBC_AD0N_67)
HYPR_2_N: U1.J16(IO_L23N_T3U_N9_67)
HYPR_2_P: U1.K16(IO_L23P_T3U_N8_67)
HYPR_2_~{RESET}: U1.L19(IO_L24P_T3U_N10_67)
HYPR_2_RWDS: U1.K15(IO_L21N_T3L_N5_AD8N_67)
USERIOA-1: U1.C14(IO_L7N_T1L_N1_QBC_AD13N_67)
USERIOA-3: U1.B14(IO_L1P_T0L_N0_DBC_67)
USERIOA-5: U1.A14(IO_L1N_T0L_N1_DBC_67)
USERIOA-7: U1.B15(IO_L3P_T0L_N4_AD15P_67)
USERIOA-9: U1.A15(IO_L3N_T0L_N5_AD15N_67)
USERIOA-11: U1.B16(IO_L5N_T0U_N9_AD14N_67)
USERIOA-13: U1.A18(IO_L2N_T0L_N3_67)
USERIOA-15: U1.C19(IO_L4P_T0U_N6_DBC_AD7P_67)
USERIOA-17: U1.A19(IO_L2P_T0L_N2_67)
USERIOA-21: U1.H18(IO_L18N_T2U_N11_AD2N_67)
USERIOA-23: U1.F19(IO_L16N_T2U_N7_QBC_AD3N_67)
USERIOA-25: U1.C18(IO_L6P_T0U_N10_AD6P_67)
USERIOA-27: U1.B19(IO_L4N_T0U_N7_DBC_AD7N_67)
USERIOA-29: U1.D14(IO_L7P_T1L_N0_QBC_AD13P_67)
USERIOA-31: U1.D15(IO_L8N_T1L_N3_AD5N_67)
USERIOA-33: U1.E15(IO_L8P_T1L_N2_AD5P_67)
USERIOA-35: U1.F14(IO_L9N_T1L_N5_AD12N_67)
USERIOA-37: U1.G17(IO_L13P_T2L_N0_GC_QBC_67)
USERIOA-39: U1.F18(IO_L14P_T2L_N2_GC_67)

Not connected (* = marked no-connect by the designer): U1 A17(IO_T0U_N12_VRP_67) B17(IO_L5P_T0U_N8_AD14P_67) C16(IO_T1U_N12_67) C17(IO_L6N_T0U_N11_AD6N_67) H14(IO_T2U_N12_67) H16(IO_L17N_T2U_N9_AD10N_67) L14(VREF_68) L17(IO_T3U_N12_67)

### Notes on the sheet
- (near U1) 1.8V
- Title:
- Date:
- Rev:
- Time:
- Project:
- Sheet
- of
- License:
- Copyright © NewAE Technology Inc.
- Approved:
- NewAE.com
- File:
- (in symbol IC-XCKU095-1156, part M) BANK 67

### Library data of the parts
U1 = IC-XCKU095-1156: as U1 on sheet CW341_FPGA_PWR; Ipc Land Pattern Name: BGA1156N100P34X34_3500X3500X342; RoHS: TRUE; Height: 3.51mm; Footprint Url: https://www.xilinx.com/support/documentation/user_guides/ug575-ultrascale-pkg-pinout.pdf; Device Class L2: Embedded Processors and Controllers; ComponentLink2URL: https://www.xilinx.com/support/documentation/data_sheets/ds890-ultrascale-overview.pdf; Temperature Range High: +100°C; Device Class L1: Integrated Circuits (ICs); Package: 0; Octopart: https://octopart.com/xcku035-3ffva1156e-xilinx-67038192?r=sp; Automotive: No; ComponentLink2Description: Datasheet; Device Class L3: FPGAs - Field Programmable Gate Arrays; Category: IC; Lead Free: Yes; Temperature: 0°C to +100°C; Temperature Range Low: 0°C; Digikey Description: IC FPGA 520 I/O 1156FCBGA